# Altium schematic sheet 06_RK3588MQ.SchDoc (part 2 of 3)
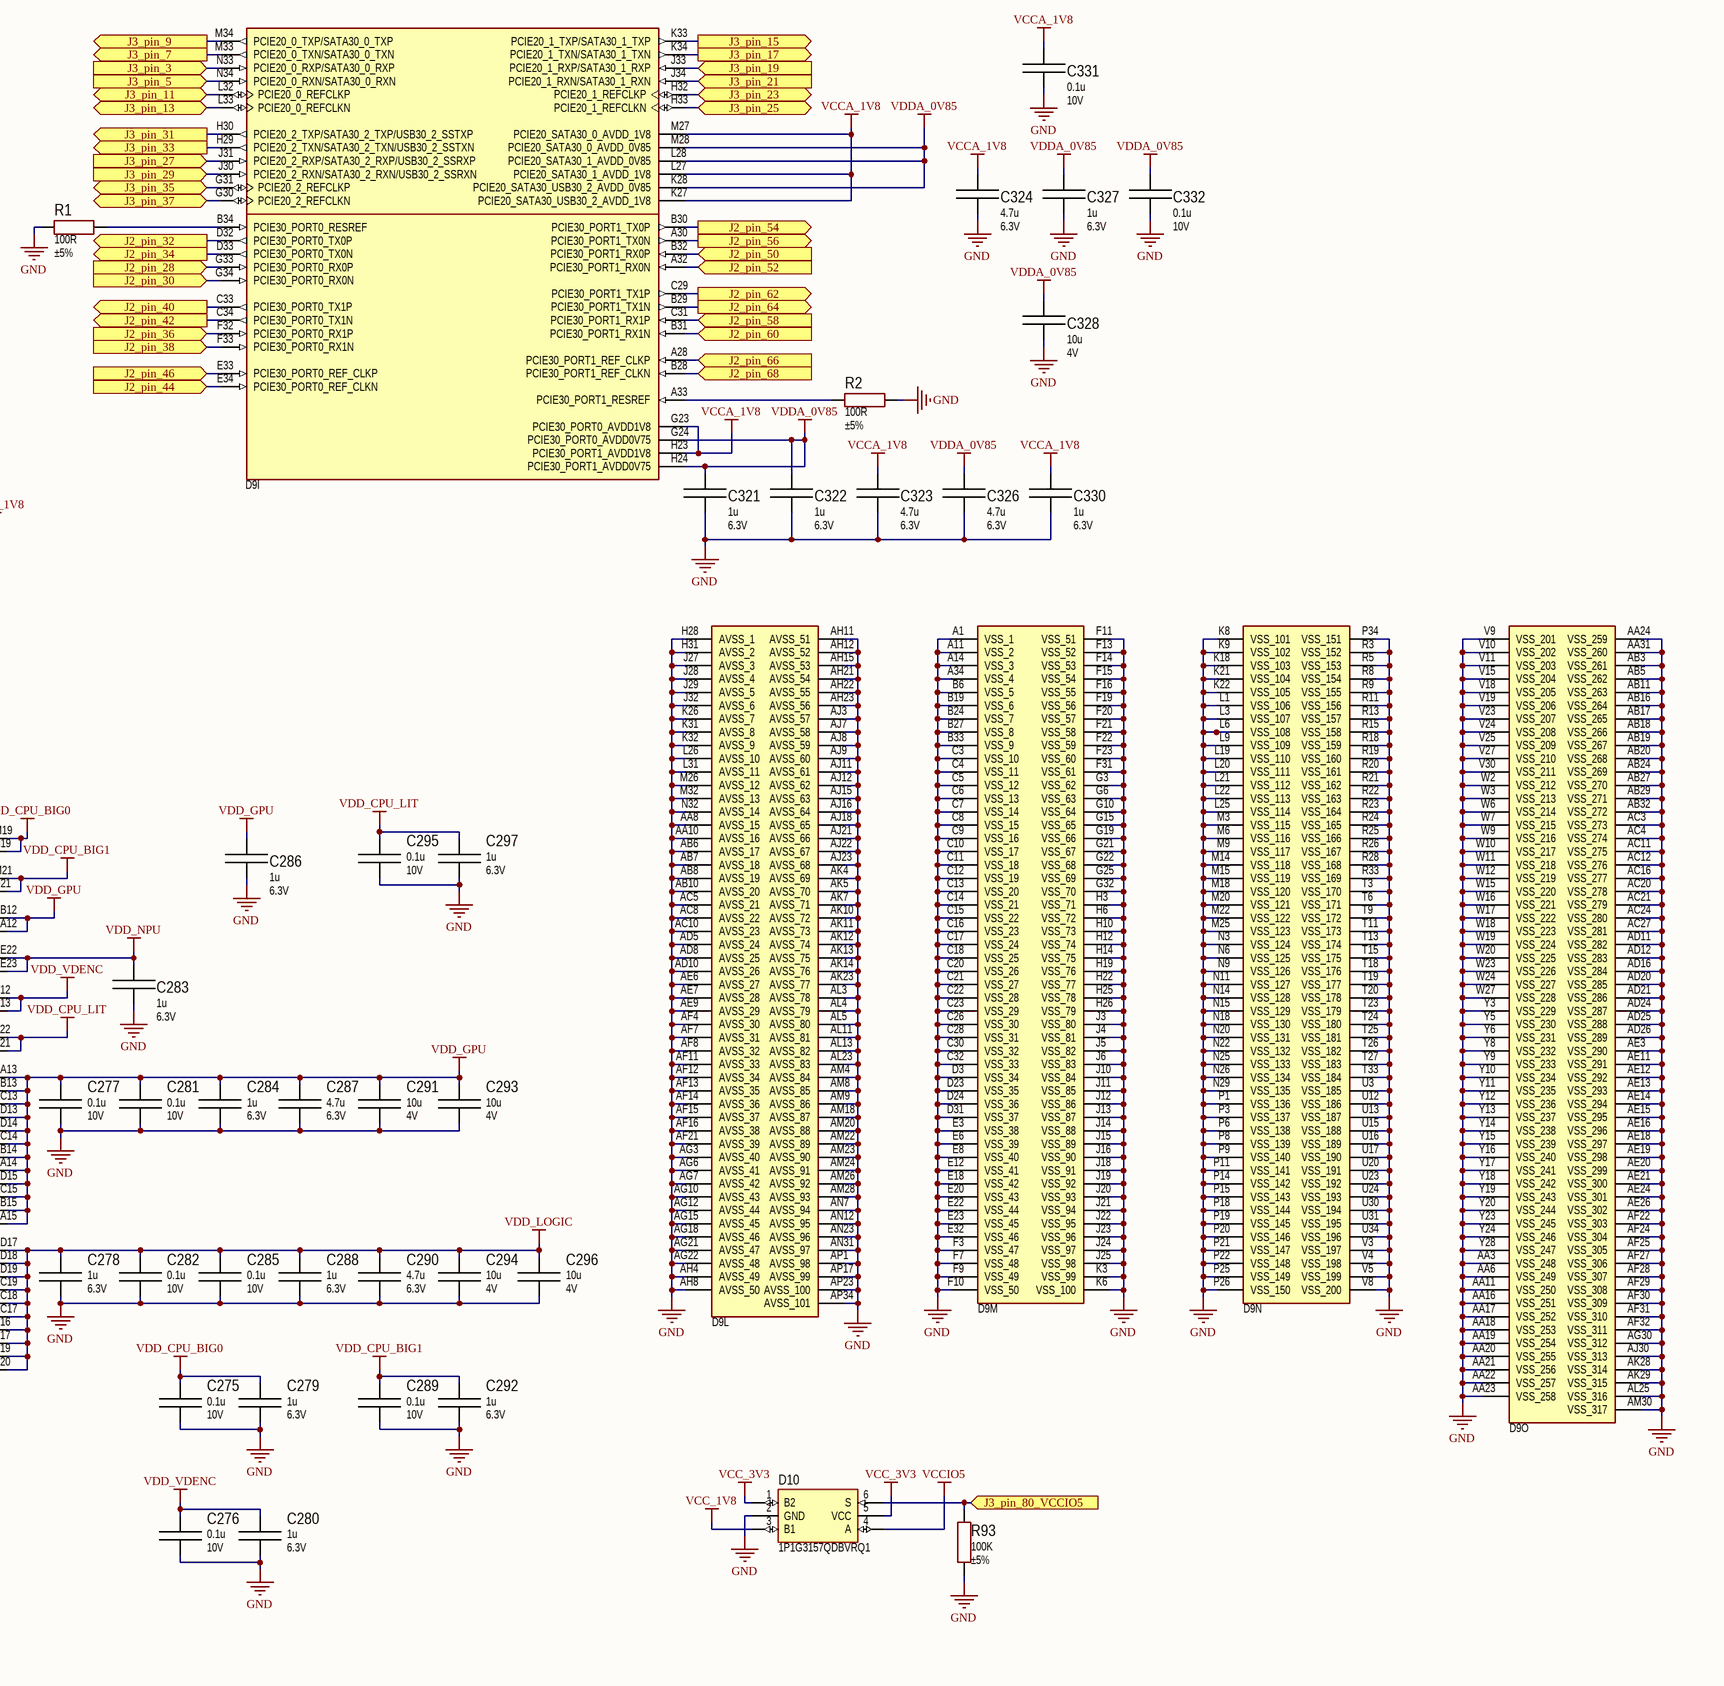
[diagram p6: 06_RK3588MQ.SchDoc, bottom right]

## Nets
GND: C193.1 C194.1 C195.1 C196.1 C197.1 C198.1 C199.1 C200.1 C201.1 C202.1 C203.1 C204.1 C205.1 C206.1 C207.1 C208.1 C209.1 C210.1 C211.1 C212.1 C214.1 C215.1 C217.1 C219.1 C220.1 C223.1 C225.1 C227.1 C228.1 C230.1 C232.1 C233.1 C234.1 C235.1 C236.1 C240.1 C241.1 C243.1 C244.1 C245.1 C246.1 C247.1 C248.1 C249.1 C250.1 C251.1 C252.1 C253.1 C254.1 C255.1 C256.1 C257.1 C258.1 C259.1 C260.1 C261.1 C262.1 C263.1 C264.1 C265.1 C266.1 C267.1 C268.1 C269.1 C270.1 C271.1 C272.1 C273.1 C274.1 C275.1 C276.1 C277.1 C278.1 C279.1 C280.1 C281.1 C282.1 C283.1 C284.1 C285.1 C286.1 C287.1 C288.1 C289.1 C290.1 C291.1 C292.1 C293.1 C294.1 C295.1 C296.1 C297.1 C303.1 C304.1 C305.1 C306.1 C307.1 C308.1 C309.1 C310.1 C311.1 C312.1 C313.1 C314.1 C316.1 C317.1 C318.1 C319.1 C320.1 C321.1 C322.1 C323.1 C324.1 C325.1 C326.1 C327.1 C328.1 C329.1 C330.1 C331.1 C332.1 C333.1 C334.1 C335.1 C336.1 C337.1 C338.1 C339.1 C340.1 C341.1 C342.1 C343.1 C344.1 C345.1 C346.1 C347.1 C348.1 C349.1 C350.1 C351.1 C352.1 D9.A1(VSS_1) D9.A11(VSS_2) D9.A14(VSS_3) D9.A34(VSS_4) D9.AA3(VSS_248) D9.AA6(VSS_249) D9.AA8(AVSS_15) D9.AA10(AVSS_16) D9.AA11(VSS_250) D9.AA16(VSS_251) D9.AA17(VSS_252) D9.AA18(VSS_253) D9.AA19(VSS_254) D9.AA20(VSS_255) D9.AA21(VSS_256) D9.AA22(VSS_257) D9.AA23(VSS_258) D9.AA24(VSS_259) D9.AA31(VSS_260) D9.AB3(VSS_261) D9.AB5(VSS_262) D9.AB6(AVSS_17) D9.AB7(AVSS_18) D9.AB8(AVSS_19) D9.AB10(AVSS_20) D9.AB11(VSS_263) D9.AB16(VSS_264) D9.AB17(VSS_265) D9.AB18(VSS_266) D9.AB19(VSS_267) D9.AB20(VSS_268) D9.AB24(VSS_269) D9.AB27(VSS_270) D9.AB29(VSS_271) D9.AB32(VSS_272) D9.AC3(VSS_273) D9.AC4(VSS_274) D9.AC5(AVSS_21) D9.AC8(AVSS_22) D9.AC10(AVSS_23) D9.AC11(VSS_275) D9.AC12(VSS_276) D9.AC16(VSS_277) D9.AC20(VSS_278) D9.AC21(VSS_279) D9.AC24(VSS_280) D9.AC27(VSS_281) D9.AD5(AVSS_24) D9.AD8(AVSS_25) D9.AD10(AVSS_26) D9.AD11(VSS_282) D9.AD12(VSS_283) D9.AD16(VSS_284) D9.AD20(VSS_285) D9.AD21(VSS_286) D9.AD24(VSS_287) D9.AD25(VSS_288) D9.AD26(VSS_289) D9.AE3(VSS_290) D9.AE6(AVSS_27) D9.AE7(AVSS_28) D9.AE9(AVSS_29) D9.AE11(VSS_291) D9.AE12(VSS_292) D9.AE13(VSS_293) D9.AE14(VSS_294) D9.AE15(VSS_295) D9.AE16(VSS_296) D9.AE18(VSS_297) D9.AE19(VSS_298) D9.AE20(VSS_299) D9.AE21(VSS_300) D9.AE24(VSS_301) D9.AE26(VSS_302) D9.AF4(AVSS_30) D9.AF7(AVSS_31) D9.AF8(AVSS_32) D9.AF11(AVSS_33) D9.AF12(AVSS_34) D9.AF13(AVSS_35) D9.AF14(AVSS_36) D9.AF15(AVSS_37) D9.AF16(AVSS_38) D9.AF21(AVSS_39) D9.AF22(VSS_303) D9.AF24(VSS_304) D9.AF25(VSS_305) D9.AF27(VSS_306) D9.AF28(VSS_307) D9.AF29(VSS_308) D9.AF30(VSS_309) D9.AF31(VSS_310) D9.AF32(VSS_311) D9.AG3(AVSS_40) D9.AG6(AVSS_41) D9.AG7(AVSS_42) D9.AG10(AVSS_43) D9.AG12(AVSS_44) D9.AG15(AVSS_45) D9.AG18(AVSS_46) D9.AG21(AVSS_47) D9.AG22(AVSS_48) D9.AG30(VSS_312) D9.AH4(AVSS_49) D9.AH8(AVSS_50) D9.AH11(AVSS_51) D9.AH12(AVSS_52) D9.AH15(AVSS_53) D9.AH21(AVSS_54) D9.AH22(AVSS_55) D9.AH23(AVSS_56) D9.AJ3(AVSS_57) D9.AJ7(AVSS_58) D9.AJ8(AVSS_59) D9.AJ9(AVSS_60) D9.AJ11(AVSS_61) D9.AJ12(AVSS_62) D9.AJ15(AVSS_63) D9.AJ16(AVSS_64) D9.AJ18(AVSS_65) D9.AJ21(AVSS_66) D9.AJ22(AVSS_67) D9.AJ23(AVSS_68) D9.AJ30(VSS_313) D9.AK4(AVSS_69) D9.AK5(AVSS_70) D9.AK7(AVSS_71) D9.AK10(AVSS_72) D9.AK11(AVSS_73) D9.AK12(AVSS_74) D9.AK13(AVSS_75) D9.AK14(AVSS_76) D9.AK23(AVSS_77) D9.AK28(VSS_314) D9.AK29(VSS_315) D9.AL3(AVSS_78) D9.AL4(AVSS_79) D9.AL5(AVSS_80) D9.AL11(AVSS_81) D9.AL13(AVSS_82) D9.AL23(AVSS_83) D9.AL25(VSS_316) D9.AM4(AVSS_84) D9.AM8(AVSS_85) D9.AM9(AVSS_86) D9.AM18(AVSS_87) D9.AM20(AVSS_88) D9.AM22(AVSS_89) D9.AM23(AVSS_90) D9.AM24(AVSS_91) D9.AM26(AVSS_92) D9.AM28(AVSS_93) D9.AM30(VSS_317) D9.AN7(AVSS_94) D9.AN12(AVSS_95) D9.AN23(AVSS_96) D9.AN31(AVSS_97) D9.AP1(AVSS_98) D9.AP17(AVSS_99) D9.AP23(AVSS_100) D9.AP34(AVSS_101) D9.B6(VSS_5) D9.B19(VSS_6) D9.B24(VSS_7) D9.B27(VSS_8) D9.B33(VSS_9) D9.C3(VSS_10) D9.C4(VSS_11) D9.C5(VSS_12) D9.C6(VSS_13) D9.C7(VSS_14) D9.C8(VSS_15) D9.C9(VSS_16) D9.C10(VSS_17) D9.C11(VSS_18) D9.C12(VSS_19) D9.C13(VSS_20) D9.C14(VSS_21) D9.C15(VSS_22) D9.C16(VSS_23) D9.C17(VSS_24) D9.C18(VSS_25) D9.C20(VSS_26) D9.C21(VSS_27) D9.C22(VSS_28) D9.C23(VSS_29) D9.C26(VSS_30) D9.C28(VSS_31) D9.C30(VSS_32) D9.C32(VSS_33) D9.D3(VSS_34) D9.D23(VSS_35) D9.D24(VSS_36) D9.D31(VSS_37) D9.E3(VSS_38) D9.E6(VSS_39) D9.E8(VSS_40) D9.E12(VSS_41) D9.E18(VSS_42) D9.E20(VSS_43) D9.E22(VSS_44) D9.E23(VSS_45) D9.E32(VSS_46) D9.F3(VSS_47) D9.F7(VSS_48) D9.F9(VSS_49) D9.F10(VSS_50) D9.F11(VSS_51) D9.F13(VSS_52) D9.F14(VSS_53) D9.F15(VSS_54) D9.F16(VSS_55) D9.F19(VSS_56) D9.F20(VSS_57) D9.F21(VSS_58) D9.F22(VSS_59) D9.F23(VSS_60) D9.F31(VSS_61) D9.G3(VSS_62) D9.G6(VSS_63) D9.G10(VSS_64) D9.G15(VSS_65) D9.G19(VSS_66) D9.G21(VSS_67) D9.G22(VSS_68) D9.G25(VSS_69) D9.G32(VSS_70) D9.H3(VSS_71) D9.H6(VSS_72) D9.H10(VSS_73) D9.H12(VSS_74) D9.H14(VSS_75) D9.H19(VSS_76) D9.H22(VSS_77) D9.H25(VSS_78) D9.H26(VSS_79) D9.H28(AVSS_1) D9.H31(AVSS_2) D9.J3(VSS_80) D9.J4(VSS_81) D9.J5(VSS_82) D9.J6(VSS_83) D9.J10(VSS_84) D9.J11(VSS_85) D9.J12(VSS_86) D9.J13(VSS_87) D9.J14(VSS_88) D9.J15(VSS_89) D9.J16(VSS_90) D9.J18(VSS_91) D9.J19(VSS_92) D9.J20(VSS_93) D9.J21(VSS_94) D9.J22(VSS_95) D9.J23(VSS_96) D9.J24(VSS_97) D9.J25(VSS_98) D9.J27(AVSS_3) D9.J28(AVSS_4) D9.J29(AVSS_5) D9.J32(AVSS_6) D9.K3(VSS_99) D9.K6(VSS_100) D9.K8(VSS_101) D9.K9(VSS_102) D9.K18(VSS_103) D9.K21(VSS_104) D9.K22(VSS_105) D9.K26(AVSS_7) D9.K31(AVSS_8) D9.K32(AVSS_9) D9.L1(VSS_106) D9.L3(VSS_107) D9.L6(VSS_108) D9.L9(VSS_109) D9.L16(DDR_CH1_PLL_AVSS) D9.L19(VSS_110) D9.L20(VSS_111) D9.L21(VSS_112) D9.L22(VSS_113) D9.L25(VSS_114) D9.L26(AVSS_10) D9.L31(AVSS_11) D9.M3(VSS_115) D9.M6(VSS_116) D9.M9(VSS_117) D9.M11(DDR_CH0_PLL_AVSS) D9.M14(VSS_118) D9.M15(VSS_119) D9.M18(VSS_120) D9.M20(VSS_121) D9.M22(VSS_122) D9.M25(VSS_123) D9.M26(AVSS_12) D9.M29(TVSS) D9.M32(AVSS_13) D9.N3(VSS_124) D9.N6(VSS_125) D9.N9(VSS_126) D9.N11(VSS_127) D9.N14(VSS_128) D9.N15(VSS_129) D9.N18(VSS_130) D9.N20(VSS_131) D9.N22(VSS_132) D9.N25(VSS_133) D9.N26(VSS_134) D9.N29(VSS_135) D9.N32(AVSS_14) D9.P1(VSS_136) D9.P3(VSS_137) D9.P6(VSS_138) D9.P8(VSS_139) D9.P9(VSS_140) D9.P11(VSS_141) D9.P14(VSS_142) D9.P15(VSS_143) D9.P18(VSS_144) D9.P19(VSS_145) D9.P20(VSS_146) D9.P21(VSS_147) D9.P22(VSS_148) D9.P25(VSS_149) D9.P26(VSS_150) D9.P34(VSS_151) D9.R3(VSS_152) D9.R5(VSS_153) D9.R8(VSS_154) D9.R9(VSS_155) D9.R11(VSS_156) D9.R13(VSS_157) D9.R15(VSS_158) D9.R18(VSS_159) D9.R19(VSS_160) D9.R20(VSS_161) D9.R21(VSS_162) D9.R22(VSS_163) D9.R23(VSS_164) D9.R24(VSS_165) D9.R25(VSS_166) D9.R26(VSS_167) D9.R28(VSS_168) D9.R33(VSS_169) D9.T3(VSS_170) D9.T6(VSS_171) D9.T9(VSS_172) D9.T11(VSS_173) D9.T13(VSS_174) D9.T15(VSS_175) D9.T18(VSS_176) D9.T19(VSS_177) D9.T20(VSS_178) D9.T23(VSS_179) D9.T24(VSS_180) D9.T25(VSS_181) D9.T26(VSS_182) D9.T27(VSS_183) D9.T33(VSS_184) D9.U3(VSS_185) D9.U12(VSS_186) D9.U13(VSS_187) D9.U15(VSS_188) D9.U16(VSS_189) D9.U17(VSS_190) D9.U19(PLL_AVSS) D9.U20(VSS_191) D9.U23(VSS_192) D9.U24(VSS_193) D9.U30(VSS_194) D9.U31(VSS_195) D9.U34(VSS_196) D9.V3(VSS_197) D9.V4(VSS_198) D9.V5(VSS_199) D9.V8(VSS_200) D9.V9(VSS_201) D9.V10(VSS_202) D9.V11(VSS_203) D9.V15(VSS_204) D9.V18(VSS_205) D9.V19(VSS_206) D9.V23(VSS_207) D9.V24(VSS_208) D9.V25(VSS_209) D9.V27(VSS_210) D9.V30(VSS_211) D9.W2(VSS_212) D9.W3(VSS_213) D9.W6(VSS_214) D9.W7(VSS_215) D9.W9(VSS_216) D9.W10(VSS_217) D9.W11(VSS_218) D9.W12(VSS_219) D9.W15(VSS_220) D9.W16(VSS_221) D9.W17(VSS_222) D9.W18(VSS_223) D9.W19(VSS_224) D9.W20(VSS_225) D9.W23(VSS_226) D9.W24(VSS_227) D9.W27(VSS_228) D9.Y3(VSS_229) D9.Y5(VSS_230) D9.Y6(VSS_231) D9.Y8(VSS_232) D9.Y9(VSS_233) D9.Y10(VSS_234) D9.Y11(VSS_235) D9.Y12(VSS_236) D9.Y13(VSS_237) D9.Y14(VSS_238) D9.Y15(VSS_239) D9.Y16(VSS_240) D9.Y17(VSS_241) D9.Y18(VSS_242) D9.Y19(VSS_243) D9.Y20(VSS_244) D9.Y23(VSS_245) D9.Y24(VSS_246) D9.Y28(VSS_247) D10.2(GND) R1.1 R2.2 R80.1 R86.1 R93.1 R94.1 R95.1 R96.2 R97.2 ZQ1.2 ZQ1.4
VCC_1V8: C199.2 C202.2 C203.2 C304.2 C305.2 C307.2 C308.2 C325.2 C333.2 C334.2 C335.2 C348.2 C352.2 D9.AA7(VCCIO2_1V8) D9.AC25(VCCIO6_1V8) D9.G20(VCCIO1_1V8) D9.H20(VCCIO4_1V8) D9.H21(VCCIO4) D9.N28(PMUIO1_1V8) D9.P28(PMUIO2) D9.R27(PMUIO2_1V8) D9.V26(EMMCIO_1V8) D9.W25(VCCIO5_1V8) D9.Y26(VCCIO3_1V8) D10.3(B1) R83.2 R84.2
VCC_3V3: C306.2 C329.2 C340.2 D9.AC26(VCCIO6) D9.AJ10(USB20_AVDD_3V3) D9.Y7(VCCIO2) D10.1(B2) D10.5(VCC)
VCCA1V8_IMAGE: C310.2 C311.2 C312.2 C313.2 C314.2 C336.2 C337.2 D9.AA26(MIPI_CSI1_AVCC1V8) D9.AB26(MIPI_CSI0_AVCC1V8) D9.AC6(HDMI/EDP_TX0_VDD_CMN_1V8) D9.AC7(HDMI/EDP_TX0_VDD_IO_1V8) D9.AD6(HDMI/EDP_TX1_VDD_CMN_1V8) D9.AD7(HDMI/EDP_TX1_VDD_IO_1V8)
VCCA_1V8: C194.2 C195.2 C209.2 C228.2 C303.2 C323.2 C324.2 C330.2 C331.2 C342.2 C343.2 C344.2 C349.2 D9.AG11(USB20_AVDD_1V8) D9.AG13(TYPEC1_DP1_VDDH_1V8) D9.AG14(TYPEC0_DP0_VDDH_1V8) D9.AH18(SARADC_AVDD_1V8) D9.G23(PCIE30_PORT0_AVDD1V8) D9.H23(PCIE30_PORT1_AVDD1V8) D9.K16(DDR_CH1_PLL_AVDD1V8) D9.K27(PCIE20_SATA30_USB30_2_AVDD_1V8) D9.L27(PCIE20_SATA30_1_AVDD_1V8) D9.M12(DDR_CH0_PLL_AVDD1V8) D9.M27(PCIE20_SATA30_0_AVDD_1V8) D9.N27(OSC_1V8) D9.U18(PLL_AVDD1V8)
VCCIO5: C309.2 D9.W26(VCCIO5) D10.4(A)
VDD2_DDR: R88.2
VDD2_DDR_CKE: C217.2 C263.2 D9.H13(DDR_CH1_VDDQ_CKE) D9.N8(DDR_CH0_VDDQ_CKE) R88.1
VDD_CPU_BIG0: C244.2 C251.2 C257.2 C265.2 C271.2 C275.2 C279.2 D9.M16(VDD_CPU_BIG0_0) D9.M17(VDD_CPU_BIG0_9) D9.M19(VDD_CPU_BIG0_MEM_0) D9.N16(VDD_CPU_BIG0_1) D9.N17(VDD_CPU_BIG0_8) D9.N19(VDD_CPU_BIG0_MEM_1) D9.P16(VDD_CPU_BIG0_2) D9.P17(VDD_CPU_BIG0_7) D9.R16(VDD_CPU_BIG0_3) D9.R17(VDD_CPU_BIG0_6) D9.T16(VDD_CPU_BIG0_4) D9.T17(VDD_CPU_BIG0_5)
VDD_CPU_BIG1: C243.2 C250.2 C258.2 C266.2 C272.2 C289.2 C292.2 D9.K23(VDD_CPU_BIG1_9) D9.K24(VDD_CPU_BIG1_0) D9.L23(VDD_CPU_BIG1_8) D9.L24(VDD_CPU_BIG1_1) D9.M21(VDD_CPU_BIG1_MEM_0) D9.M23(VDD_CPU_BIG1_7) D9.M24(VDD_CPU_BIG1_2) D9.N21(VDD_CPU_BIG1_MEM_1) D9.N23(VDD_CPU_BIG1_6) D9.N24(VDD_CPU_BIG1_3) D9.P23(VDD_CPU_BIG1_5) D9.P24(VDD_CPU_BIG1_4)
VDD_CPU_LIT: C225.2 C235.2 C249.2 C256.2 C264.2 C270.2 C295.2 C297.2 D9.T21(VDD_CPU_LIT_MEM_1) D9.T22(VDD_CPU_LIT_MEM_0) D9.U21(VDD_CPU_LIT_7) D9.U22(VDD_CPU_LIT_0) D9.V21(VDD_CPU_LIT_6) D9.V22(VDD_CPU_LIT_1) D9.W21(VDD_CPU_LIT_5) D9.W22(VDD_CPU_LIT_2) D9.Y21(VDD_CPU_LIT_4) D9.Y22(VDD_CPU_LIT_3)
VDD_DDR: C206.2 C208.2 C212.2 C215.2 C220.2 C230.2 C234.2 C241.2 C247.2 C254.2 D9.L11(DDR_CH1_VDD_0) D9.L12(DDR_CH1_VDD_1) D9.L13(DDR_CH1_VDD_2) D9.L14(DDR_CH1_VDD_3) D9.L17(DDR_CH1_VDD_MIF_0) D9.L18(DDR_CH1_VDD_MIF_1) D9.N13(DDR_CH0_VDD_MIF_0) D9.P12(DDR_CH0_VDD_3) D9.P13(DDR_CH0_VDD_MIF_1) D9.R12(DDR_CH0_VDD_2) D9.T12(DDR_CH0_VDD_1) D9.U11(DDR_CH0_VDD_0)
VDD_GPU: C277.2 C281.2 C284.2 C286.2 C287.2 C291.2 C293.2 D9.AA12(VDD_GPU_MEM_0) D9.AA13(VDD_GPU_0) D9.AA14(VDD_GPU_7) D9.AA15(VDD_GPU_11) D9.AB12(VDD_GPU_MEM_1) D9.AB13(VDD_GPU_1) D9.AB14(VDD_GPU_6) D9.AB15(VDD_GPU_10) D9.AC13(VDD_GPU_2) D9.AC14(VDD_GPU_5) D9.AC15(VDD_GPU_9) D9.AD13(VDD_GPU_3) D9.AD14(VDD_GPU_4) D9.AD15(VDD_GPU_8)
VDD_LOGIC: C278.2 C282.2 C285.2 C288.2 C290.2 C294.2 C296.2 D9.AC17(VDD_LOGIC_5) D9.AC18(VDD_LOGIC_4) D9.AC19(VDD_LOGIC_3) D9.AD17(VDD_LOGIC_0) D9.AD18(VDD_LOGIC_1) D9.AD19(VDD_LOGIC_2) D9.K19(VDD_LOGIC_8) D9.K20(VDD_LOGIC_9) D9.V16(VDD_LOGIC_6) D9.V17(VDD_LOGIC_7)
VDD_NPU: C248.2 C255.2 C261.2 C268.2 C283.2 D9.AB21(VDD_NPU_6) D9.AB22(VDD_NPU_5) D9.AB23(VDD_NPU_2) D9.AC22(VDD_NPU_4) D9.AC23(VDD_NPU_1) D9.AD22(VDD_NPU_3) D9.AD23(VDD_NPU_0) D9.AE22(VDD_NPU_MEM_0) D9.AE23(VDD_NPU_MEM_1)
VDD_VDENC: C232.2 C245.2 C252.2 C259.2 C267.2 C269.2 C276.2 C280.2 D9.R14(VDD_VDENC_0) D9.T14(VDD_VDENC_1) D9.U14(VDD_VDENC_2) D9.V12(VDD_VDENC_MEM_0) D9.V13(VDD_VDENC_MEM_1) D9.V14(VDD_VDENC_3) D9.W13(VDD_VDENC_5) D9.W14(VDD_VDENC_4)
VDDA0V75_IMAGE: C316.2 C317.2 C318.2 C319.2 C320.2 D9.AA9(HDMI/EDP_TX0_VDD_0V75) D9.AB9(HDMI/EDP_TX0_AVDD_0V75) D9.AC9(HDMI/EDP_TX1_AVDD_0V75) D9.AD9(HDMI/EDP_TX1_VDD_0V75)
VDDA_0V75: C338.2 C339.2 C341.2 C351.2 D9.AA25(MIPI_CSI1_AVCC0V75) D9.AB25(MIPI_CSI0_AVCC0V75) D9.AD3(OTP_VDDOTP_0V75) D9.AH10(USB20_DVDD_0V75) D9.V20(PLL_DVDD0V75)
VDDA_0V75_PMU: C196.2 C198.2 C200.2 C201.2 D9.P27(PMU_0V75)
VDDA_0V85: C321.2 C322.2 C326.2 C327.2 C328.2 C332.2 C345.2 C346.2 C347.2 C350.2 D9.AH13(TYPEC1_DP1_VDD_0V85) D9.AH14(TYPEC0_DP0_VDDA_0V85) D9.AJ13(TYPEC1_DP1_VDDA_0V85) D9.AJ14(TYPEC0_DP0_VDD_0V85) D9.G24(PCIE30_PORT0_AVDD0V75) D9.H24(PCIE30_PORT1_AVDD0V75) D9.K28(PCIE20_SATA30_USB30_2_AVDD_0V85) D9.L28(PCIE20_SATA30_1_AVDD_0V85) D9.M28(PCIE20_SATA30_0_AVDD_0V85)
VDDA_DDR_PLL: C211.2 C236.2 D9.L15(DDR_CH1_PLL_DVDD) D9.N12(DDR_CH0_PLL_DVDD)
VDDQ_DDR: C205.2 C207.2 C210.2 C214.2 C219.2 C223.2 C227.2 C233.2 C240.2 C246.2 C253.2 C260.2 D9.K11(DDR_CH1_VDDQ_0) D9.K12(DDR_CH1_VDDQ_1) D9.K13(DDR_CH1_VDDQ_2) D9.K14(DDR_CH1_VDDQ_3) D9.K15(DDR_CH1_VDDQ_4) D9.M10(DDR_CH0_VDDQ_0) D9.N10(DDR_CH0_VDDQ_1) D9.P10(DDR_CH0_VDDQ_2) D9.R10(DDR_CH0_VDDQ_3) D9.T10(DDR_CH0_VDDQ_4) R73.1 R76.2 R81.1 R82.2 R89.2
VDDQ_DDR_CK: C204.2 C262.2 C273.2 D9.L10(DDR_CH0_VDDQ_CK) D9.M13(DDR_CH1_VDDQ_CK) R89.1
DDR_CH0_A0_A: D9.T7(DDR_CH0_A0_A) ; port DDR_CH0_A0_A
DDR_CH0_A0_B: D9.M8(DDR_CH0_A0_B) ; port DDR_CH0_A0_B
DDR_CH0_A1_A: D9.T8(DDR_CH0_A1_A) ; port DDR_CH0_A1_A
DDR_CH0_A1_B: D9.M5(DDR_CH0_A1_B) ; port DDR_CH0_A1_B
DDR_CH0_A2_A: D9.P4(DDR_CH0_A2_A) ; port DDR_CH0_A2_A
DDR_CH0_A2_B: D9.N5(DDR_CH0_A2_B) ; port DDR_CH0_A2_B
DDR_CH0_A3_A: D9.P5(DDR_CH0_A3_A) ; port DDR_CH0_A3_A
DDR_CH0_A3_B: D9.N4(DDR_CH0_A3_B) ; port DDR_CH0_A3_B
DDR_CH0_A4_A: D9.R1(DDR_CH0_A4_A) ; port DDR_CH0_A4_A
DDR_CH0_A4_B: D9.K1(DDR_CH0_A4_B) ; port DDR_CH0_A4_B
DDR_CH0_A5_A: D9.P2(DDR_CH0_A5_A) ; port DDR_CH0_A5_A
DDR_CH0_A5_B: D9.L2(DDR_CH0_A5_B) ; port DDR_CH0_A5_B
DDR_CH0_CLKN_A: D9.N1(DDR_CH0_CKB_A) ; port DDR_CH0_CLKN_A
DDR_CH0_CLKN_B: D9.M1(DDR_CH0_CKB_B) ; port DDR_CH0_CLKN_B
DDR_CH0_CLKP_A: D9.N2(DDR_CH0_CK_A) ; port DDR_CH0_CLKP_A
DDR_CH0_CLKP_B: D9.M2(DDR_CH0_CK_B) ; port DDR_CH0_CLKP_B
DDR_CH0_DM0_A: D9.Y4(DDR_CH0_DM0_A) ; port DDR_CH0_DM0_A
DDR_CH0_DM0_B: D9.G4(DDR_CH0_DM0_B) ; port DDR_CH0_DM0_B
DDR_CH0_DM1_A: D9.AB4(DDR_CH0_DM1_A) ; port DDR_CH0_DM1_A
DDR_CH0_DM1_B: D9.E4(DDR_CH0_DM1_B) ; port DDR_CH0_DM1_B
DDR_CH0_DQ0_A: D9.U1(DDR_CH0_DQ0_A) ; port DDR_CH0_DQ0_A
DDR_CH0_DQ0_B: D9.H1(DDR_CH0_DQ0_B) ; port DDR_CH0_DQ0_B
DDR_CH0_DQ1_A: D9.T2(DDR_CH0_DQ1_A) ; port DDR_CH0_DQ1_A
DDR_CH0_DQ1_B: D9.J2(DDR_CH0_DQ1_B) ; port DDR_CH0_DQ1_B
DDR_CH0_DQ2_A: D9.T1(DDR_CH0_DQ2_A) ; port DDR_CH0_DQ2_A
DDR_CH0_DQ2_B: D9.J1(DDR_CH0_DQ2_B) ; port DDR_CH0_DQ2_B
DDR_CH0_DQ3_A: D9.R2(DDR_CH0_DQ3_A) ; port DDR_CH0_DQ3_A
DDR_CH0_DQ3_B: D9.K2(DDR_CH0_DQ3_B) ; port DDR_CH0_DQ3_B
DDR_CH0_DQ4_A: D9.W1(DDR_CH0_DQ4_A) ; port DDR_CH0_DQ4_A
DDR_CH0_DQ4_B: D9.F1(DDR_CH0_DQ4_B) ; port DDR_CH0_DQ4_B
DDR_CH0_DQ5_A: D9.V2(DDR_CH0_DQ5_A) ; port DDR_CH0_DQ5_A
DDR_CH0_DQ5_B: D9.G2(DDR_CH0_DQ5_B) ; port DDR_CH0_DQ5_B
DDR_CH0_DQ6_A: D9.V1(DDR_CH0_DQ6_A) ; port DDR_CH0_DQ6_A
DDR_CH0_DQ6_B: D9.G1(DDR_CH0_DQ6_B) ; port DDR_CH0_DQ6_B
DDR_CH0_DQ7_A: D9.U2(DDR_CH0_DQ7_A) ; port DDR_CH0_DQ7_A
DDR_CH0_DQ7_B: D9.H2(DDR_CH0_DQ7_B) ; port DDR_CH0_DQ7_B
DDR_CH0_DQ8_A: D9.AB2(DDR_CH0_DQ8_A) ; port DDR_CH0_DQ8_A
DDR_CH0_DQ8_B: D9.D2(DDR_CH0_DQ8_B) ; port DDR_CH0_DQ8_B
DDR_CH0_DQ9_A: D9.AB1(DDR_CH0_DQ9_A) ; port DDR_CH0_DQ9_A
DDR_CH0_DQ9_B: D9.C1(DDR_CH0_DQ9_B) ; port DDR_CH0_DQ9_B
DDR_CH0_DQ10_A: D9.AC1(DDR_CH0_DQ10_A) ; port DDR_CH0_DQ10_A
DDR_CH0_DQ10_B: D9.C2(DDR_CH0_DQ10_B) ; port DDR_CH0_DQ10_B
DDR_CH0_DQ11_A: D9.AC2(DDR_CH0_DQ11_A) ; port DDR_CH0_DQ11_A
DDR_CH0_DQ11_B: D9.B1(DDR_CH0_DQ11_B) ; port DDR_CH0_DQ11_B
DDR_CH0_DQ12_A: D9.Y1(DDR_CH0_DQ12_A) ; port DDR_CH0_DQ12_A
DDR_CH0_DQ12_B: D9.F2(DDR_CH0_DQ12_B) ; port DDR_CH0_DQ12_B
DDR_CH0_DQ13_A: D9.Y2(DDR_CH0_DQ13_A) ; port DDR_CH0_DQ13_A
DDR_CH0_DQ13_B: D9.E1(DDR_CH0_DQ13_B) ; port DDR_CH0_DQ13_B
DDR_CH0_DQ14_A: D9.AA1(DDR_CH0_DQ14_A) ; port DDR_CH0_DQ14_A
DDR_CH0_DQ14_B: D9.E2(DDR_CH0_DQ14_B) ; port DDR_CH0_DQ14_B
DDR_CH0_DQ15_A: D9.AA2(DDR_CH0_DQ15_A) ; port DDR_CH0_DQ15_A
DDR_CH0_DQ15_B: D9.D1(DDR_CH0_DQ15_B) ; port DDR_CH0_DQ15_B
DDR_CH0_DQS0N_A: D9.U4(DDR_CH0_DQS0N_A) ; port DDR_CH0_DQS0N_A
DDR_CH0_DQS0N_B: D9.J7(DDR_CH0_DQS0N_B) ; port DDR_CH0_DQS0N_B
DDR_CH0_DQS0P_A: D9.U5(DDR_CH0_DQS0P_A) ; port DDR_CH0_DQS0P_A
DDR_CH0_DQS0P_B: D9.J8(DDR_CH0_DQS0P_B) ; port DDR_CH0_DQS0P_B
DDR_CH0_DQS1N_A: D9.AA4(DDR_CH0_DQS1N_A) ; port DDR_CH0_DQS1N_A
DDR_CH0_DQS1N_B: D9.F4(DDR_CH0_DQS1N_B) ; port DDR_CH0_DQS1N_B
DDR_CH0_DQS1P_A: D9.AA5(DDR_CH0_DQS1P_A) ; port DDR_CH0_DQS1P_A
DDR_CH0_DQS1P_B: D9.F5(DDR_CH0_DQS1P_B) ; port DDR_CH0_DQS1P_B
DDR_CH0_LP4/4X_CKE0/LP5_CS0_A: D9.P7(DDR_CH0_LP4/4X_CKE0/LP5_CS0_A) ; port DDR_CH0_LP4/4X_CKE0/LP5_CS0_A
DDR_CH0_LP4/4X_CKE0/LP5_CS0_B: D9.L5(DDR_CH0_LP4/4X_CKE0/LP5_CS0_B) ; port DDR_CH0_LP4/4X_CKE0/LP5_CS0_B
DDR_CH0_LP4/4X_CKE1/LP5_CS1_A: D9.N7(DDR_CH0_LP4/4X_CKE1/LP5_CS1_A) ; port DDR_CH0_LP4/4X_CKE1/LP5_CS1_A
DDR_CH0_LP4/4X_CKE1/LP5_CS1_B: D9.L4(DDR_CH0_LP4/4X_CKE1/LP5_CS1_B) ; port DDR_CH0_LP4/4X_CKE1/LP5_CS1_B
DDR_CH0_LP4/4X_CS0_A: D9.R6(DDR_CH0_LP4/4X_CS0_A) ; port DDR_CH0_LP4/4X_CS0_A
DDR_CH0_LP4/4X_CS0_B: D9.L7(DDR_CH0_LP4/4X_CS0_B) ; port DDR_CH0_LP4/4X_CS0_B
DDR_CH0_LP4/4X_CS1_A: D9.R7(DDR_CH0_LP4/4X_CS1_A) ; port DDR_CH0_LP4/4X_CS1_A
DDR_CH0_LP4/4X_CS1_B: D9.L8(DDR_CH0_LP4/4X_CS1_B) ; port DDR_CH0_LP4/4X_CS1_B
DDR_CH1_A0_C: D9.G12(DDR_CH1_A0_C) ; port DDR_CH1_A0_C
DDR_CH1_A0_D: D9.H15(DDR_CH1_A0_D) ; port DDR_CH1_A0_D
DDR_CH1_A1_C: D9.F12(DDR_CH1_A1_C) ; port DDR_CH1_A1_C
DDR_CH1_A1_D: D9.G14(DDR_CH1_A1_D) ; port DDR_CH1_A1_D
DDR_CH1_A2_C: D9.E13(DDR_CH1_A2_C) ; port DDR_CH1_A2_C
DDR_CH1_A2_D: D9.G13(DDR_CH1_A2_D) ; port DDR_CH1_A2_D
DDR_CH1_A3_C: D9.D13(DDR_CH1_A3_C) ; port DDR_CH1_A3_C
DDR_CH1_A3_D: D9.E14(DDR_CH1_A3_D) ; port DDR_CH1_A3_D
DDR_CH1_A4_C: D9.A10(DDR_CH1_A4_C) ; port DDR_CH1_A4_C
DDR_CH1_A4_D: D9.A15(DDR_CH1_A4_D) ; port DDR_CH1_A4_D
DDR_CH1_A5_C: D9.B11(DDR_CH1_A5_C) ; port DDR_CH1_A5_C
DDR_CH1_A5_D: D9.B14(DDR_CH1_A5_D) ; port DDR_CH1_A5_D
DDR_CH1_CLKN_C: D9.A12(DDR_CH1_CKB_C) ; port DDR_CH1_CLKN_C
DDR_CH1_CLKN_D: D9.A13(DDR_CH1_CKB_D) ; port DDR_CH1_CLKN_D
DDR_CH1_CLKP_C: D9.B12(DDR_CH1_CK_C) ; port DDR_CH1_CLKP_C
DDR_CH1_CLKP_D: D9.B13(DDR_CH1_CK_D) ; port DDR_CH1_CLKP_D
DDR_CH1_DM0_C: D9.F8(DDR_CH1_DM0_C) ; port DDR_CH1_DM0_C
DDR_CH1_DM0_D: D9.D20(DDR_CH1_DM0_D) ; port DDR_CH1_DM0_D
DDR_CH1_DM1_C: D9.D4(DDR_CH1_DM1_C) ; port DDR_CH1_DM1_C
DDR_CH1_DM1_D: D9.D22(DDR_CH1_DM1_D) ; port DDR_CH1_DM1_D
DDR_CH1_DQ0_C: D9.A8(DDR_CH1_DQ0_C) ; port DDR_CH1_DQ0_C
DDR_CH1_DQ0_D: D9.A17(DDR_CH1_DQ0_D) ; port DDR_CH1_DQ0_D
DDR_CH1_DQ1_C: D9.B9(DDR_CH1_DQ1_C) ; port DDR_CH1_DQ1_C
DDR_CH1_DQ1_D: D9.B16(DDR_CH1_DQ1_D) ; port DDR_CH1_DQ1_D
DDR_CH1_DQ2_C: D9.A9(DDR_CH1_DQ2_C) ; port DDR_CH1_DQ2_C
DDR_CH1_DQ2_D: D9.A16(DDR_CH1_DQ2_D) ; port DDR_CH1_DQ2_D
DDR_CH1_DQ3_C: D9.B10(DDR_CH1_DQ3_C) ; port DDR_CH1_DQ3_C
DDR_CH1_DQ3_D: D9.B15(DDR_CH1_DQ3_D) ; port DDR_CH1_DQ3_D
DDR_CH1_DQ4_C: D9.A6(DDR_CH1_DQ4_C) ; port DDR_CH1_DQ4_C
DDR_CH1_DQ4_D: D9.A19(DDR_CH1_DQ4_D) ; port DDR_CH1_DQ4_D
DDR_CH1_DQ5_C: D9.B7(DDR_CH1_DQ5_C) ; port DDR_CH1_DQ5_C
DDR_CH1_DQ5_D: D9.B18(DDR_CH1_DQ5_D) ; port DDR_CH1_DQ5_D
DDR_CH1_DQ6_C: D9.A7(DDR_CH1_DQ6_C) ; port DDR_CH1_DQ6_C
DDR_CH1_DQ6_D: D9.A18(DDR_CH1_DQ6_D) ; port DDR_CH1_DQ6_D
DDR_CH1_DQ7_C: D9.B8(DDR_CH1_DQ7_C) ; port DDR_CH1_DQ7_C
DDR_CH1_DQ7_D: D9.B17(DDR_CH1_DQ7_D) ; port DDR_CH1_DQ7_D
DDR_CH1_DQ8_C: D9.A3(DDR_CH1_DQ8_C) ; port DDR_CH1_DQ8_C
DDR_CH1_DQ8_D: D9.A22(DDR_CH1_DQ8_D) ; port DDR_CH1_DQ8_D
DDR_CH1_DQ9_C: D9.B3(DDR_CH1_DQ9_C) ; port DDR_CH1_DQ9_C
DDR_CH1_DQ9_D: D9.B22(DDR_CH1_DQ9_D) ; port DDR_CH1_DQ9_D
DDR_CH1_DQ10_C: D9.A2(DDR_CH1_DQ10_C) ; port DDR_CH1_DQ10_C
DDR_CH1_DQ10_D: D9.A23(DDR_CH1_DQ10_D) ; port DDR_CH1_DQ10_D
DDR_CH1_DQ11_C: D9.B2(DDR_CH1_DQ11_C) ; port DDR_CH1_DQ11_C
DDR_CH1_DQ11_D: D9.B23(DDR_CH1_DQ11_D) ; port DDR_CH1_DQ11_D
DDR_CH1_DQ12_C: D9.A5(DDR_CH1_DQ12_C) ; port DDR_CH1_DQ12_C
DDR_CH1_DQ12_D: D9.A20(DDR_CH1_DQ12_D) ; port DDR_CH1_DQ12_D
DDR_CH1_DQ13_C: D9.B5(DDR_CH1_DQ13_C) ; port DDR_CH1_DQ13_C
DDR_CH1_DQ13_D: D9.B20(DDR_CH1_DQ13_D) ; port DDR_CH1_DQ13_D
DDR_CH1_DQ14_C: D9.A4(DDR_CH1_DQ14_C) ; port DDR_CH1_DQ14_C
DDR_CH1_DQ14_D: D9.A21(DDR_CH1_DQ14_D) ; port DDR_CH1_DQ14_D
DDR_CH1_DQ15_C: D9.B4(DDR_CH1_DQ15_C) ; port DDR_CH1_DQ15_C
DDR_CH1_DQ15_D: D9.B21(DDR_CH1_DQ15_D) ; port DDR_CH1_DQ15_D
DDR_CH1_DQS0N_C: D9.D9(DDR_CH1_DQS0N_C) ; port DDR_CH1_DQS0N_C
DDR_CH1_DQS0N_D: D9.G16(DDR_CH1_DQS0N_D) ; port DDR_CH1_DQS0N_D
DDR_CH1_DQS0P_C: D9.E9(DDR_CH1_DQS0P_C) ; port DDR_CH1_DQS0P_C
DDR_CH1_DQS0P_D: D9.H16(DDR_CH1_DQS0P_D) ; port DDR_CH1_DQS0P_D
DDR_CH1_DQS1N_C: D9.D5(DDR_CH1_DQS1N_C) ; port DDR_CH1_DQS1N_C
DDR_CH1_DQS1N_D: D9.E21(DDR_CH1_DQS1N_D) ; port DDR_CH1_DQS1N_D
DDR_CH1_DQS1P_C: D9.E5(DDR_CH1_DQS1P_C) ; port DDR_CH1_DQS1P_C
DDR_CH1_DQS1P_D: D9.D21(DDR_CH1_DQS1P_D) ; port DDR_CH1_DQS1P_D
DDR_CH1_LP4/4X_CKE0/LP5_CS0_C: D9.D11(DDR_CH1_LP4/4X_CKE0/LP5_CS0_C) ; port DDR_CH1_LP4/4X_CKE0/LP5_CS0_C
DDR_CH1_LP4/4X_CKE0/LP5_CS0_D: D9.D16(DDR_CH1_LP4/4X_CKE0/LP5_CS0_D) ; port DDR_CH1_LP4/4X_CKE0/LP5_CS0_D
DDR_CH1_LP4/4X_CKE1/LP5_CS1_C: D9.E11(DDR_CH1_LP4/4X_CKE1/LP5_CS1_C) ; port DDR_CH1_LP4/4X_CKE1/LP5_CS1_C
DDR_CH1_LP4/4X_CKE1/LP5_CS1_D: D9.E16(DDR_CH1_LP4/4X_CKE1/LP5_CS1_D) ; port DDR_CH1_LP4/4X_CKE1/LP5_CS1_D
DDR_CH1_LP4/4X_CS0_C: D9.G11(DDR_CH1_LP4/4X_CS0_C) ; port DDR_CH1_LP4/4X_CS0_C
DDR_CH1_LP4/4X_CS0_D: D9.E19(DDR_CH1_LP4/4X_CS0_D) ; port DDR_CH1_LP4/4X_CS0_D
DDR_CH1_LP4/4X_CS1_C: D9.H11(DDR_CH1_LP4/4X_CS1_C) ; port DDR_CH1_LP4/4X_CS1_C
DDR_CH1_LP4/4X_CS1_D: D9.D19(DDR_CH1_LP4/4X_CS1_D) ; port DDR_CH1_LP4/4X_CS1_D
DDR_RESET: D9.T4(DDR_CH0_RESET_A) ; port DDR_RESET
eMMC_CLKOUT: D9.V34(EMMC_CLKOUT/GPIO2_A1_D) ; port eMMC_CLKOUT
eMMC_CMD: D9.W34(EMMC_CMD/FSPI_CLK_M0/GPIO2_A0_U) ; port eMMC_CMD
eMMC_D0: D9.Y33(EMMC_D0/FSPI_D0_M0/GPIO2_D0_U) ; port eMMC_D0
eMMC_D1: D9.W33(EMMC_D1/FSPI_D1_M0/GPIO2_D1_U) ; port eMMC_D1
eMMC_D2: D9.V32(EMMC_D2/FSPI_D2_M0/GPIO2_D2_U) ; port eMMC_D2
eMMC_D3: D9.AA33(EMMC_D3/FSPI_D3_M0/GPIO2_D3_U) ; port eMMC_D3
eMMC_D4: D9.Y32(EMMC_D4/I2C1_SCL_M3/UART5_RX_M2/GPIO2_D4_U) ; port eMMC_D4
eMMC_D5: D9.AA32(EMMC_D5/I2C1_SDA_M3/UART5_TX_M2/GPIO2_D5_U) ; port eMMC_D5
eMMC_D6: D9.W32(EMMC_D6/FSPI_CS0N_M0/GPIO2_D6_U) ; port eMMC_D6
eMMC_D7: D9.V33(EMMC_D7/FSPI_CS1N_M0/GPIO2_D7_U) ; port eMMC_D7
eMMC_DATA_STROBE: D9.Y34(EMMC_DATA_STROBE/I2C2_SDA_M2/UART5_CTSN_M1/GPIO2_A2_D) ; port eMMC_DATA_STROBE
eMMC_RSTn: D9.AA34(EMMC_RSTN/I2C2_SCL_M2/UART5_RTSN_M1/GPIO2_A3_D) ; port eMMC_RSTn
I2C0_SCL_M2: D9.W30(I2S1_SDO0_M1/CPU_BIG0_AVS/I2C0_SCL_M2/UART0_CTSN/UART1_TX_M2/HDMI_RX_SDA_M0/SPI0_CS0_M0/PCIE30X2_CLKREQN_M0/HDMI_TX0_CEC_M1/GPIO0_D1_U) R83.1 ; port I2C0_SCL_M2
I2C0_SDA_M2: D9.W29(I2S1_SDO1_M1/I2C0_SDA_M2/UART1_RX_M2/HDMI_RX_SCL_M0/SPI3_MOSI_M2/PCIE30X2_WAKEN_M0/HDMI_TX1_CEC_M1/GPIO0_D2_U) R84.1 ; port I2C0_SDA_M2
J1_pin_22_3V3: D9.AK25(CIF_HREF/BT1120_D8/I2S1_SDO1_M0/PCIE30X1_1_BUTTON_RSTN/I2C7_SCL_M3/UART8_RTSN_M0/PWM14_M1/SPI0_CS0_M1/CAN1_RX_M1/GPIO4_B2_U) ; port J1_pin_22_3V3
J1_pin_23_3V3: D9.AL24(MIPI_CAMERA0_CLK_M0/SPDIF1_TX_M1/I2S1_SDO0_M0/PCIE30X1_0_BUTTON_RSTN/SATA2_ACT_LED_M0/I2C6_SCL_M3/UART8_RX_M0/SPI0_CS1_M1/GPIO4_B1_U) ; port J1_pin_23_3V3
J1_pin_24_VCCIO5: D9.AH25(CIF_D9/FSPI_CS1N_M2/PCIE30X4_WAKEN_M2/HDMI_TX1_SDA_M1/CAN2_TX_M0/UART5_RX_M1/SPI3_CS1_M3/GPIO3_C5_U_VCCIO_5) ; port J1_pin_24_VCCIO5
J1_pin_25_3V3: D9.AK24(BT1120_D15/SPDIF1_TX_M2/PCIE20X1_2_PERSTN_M1/HDMI_TX0_CEC_M0/I2C8_SDA_M3/PWM6_M1/SPI3_CS1_M1/GPIO4_C1_D) ; port J1_pin_25_3V3
J1_pin_26_VCCIO5: D9.AG26(CIF_D10/PCIE30X4_PERSTN_M2/HDMI_TX1_SCL_M1/SPI3_MISO_M3/GPIO3_C6_U_VCCIO_5) ; port J1_pin_26_VCCIO5
J1_pin_27_3V3: D9.AJ25(BT1120_D14/PCIE20X1_2_WAKEN_M1/HDMI_TX0_SDA_M0/I2C8_SCL_M3/SPI3_CS0_M1/GPIO4_C0_U) ; port J1_pin_27_3V3
J1_pin_28_VCCIO5: D9.AH26(CIF_D8/FSPI_CS0N_M2/PCIE30X4_CLKREQN_M2/HDMI_TX1_CEC_M2/CAN2_RX_M0/UART5_TX_M1/SPI3_CS0_M3/GPIO3_C4_U_VCCIO_5) ; port J1_pin_28_VCCIO5
J1_pin_29_3V3: D9.AJ28(BT1120_D13/PCIE20X1_2_CLKREQN_M1/HDMI_TX0_SCL_M0/I2C5_SDA_M1/SPI3_CLK_M1/GPIO4_B7_U) ; port J1_pin_29_3V3
J1_pin_30_3V3: D9.AL26(CIF_CLKOUT/BT1120_D10/I2S1_SDO3_M0/PCIE30X4_CLKREQN_M1/DP0_HPDIN_M0/SPDIF0_TX_M1/UART9_TX_M1/PWM11_IR_M1/GPIO4_B4_U) ; port J1_pin_30_3V3
J1_pin_31_3V3: D9.AK8(TYPEC1_USB20_OTG_ID) ; port J1_pin_31_3V3
J1_pin_32_3V3: D9.AK30(CIF_D0/BT1120_D0/I2S1_MCLK_M0/PCIE30X1_1_CLKREQN_M1/UART9_RTSN_M1/SPI0_MISO_M1/GPIO4_A0_D) ; port J1_pin_32_3V3
J1_pin_33_3V3: D9.AL8(TYPEC1_USB20_VBUSDET) ; port J1_pin_33_3V3
J1_pin_34_3V3: D9.AL30(CIF_D1/BT1120_D1/I2S1_SCLK_M0/PCIE30X1_1_WAKEN_M1/UART9_CTSN_M1/SPI0_MOSI_M1/GPIO4_A1_D) ; port J1_pin_34_3V3
J1_pin_35_1V8: D9.AL14(TYPEC0_USB20_OTG_ID) ; port J1_pin_35_1V8
J1_pin_36_3V3: D9.AJ27(BT1120_D12/PCIE30X4_PERSTN_M1/HDMI_RX_HPDOUT_M0/SATA0_ACT_LED_M0/I2C5_SCL_M1/PWM13_M1/SPI3_MOSI_M1/GPIO4_B6_D) ; port J1_pin_36_3V3
J1_pin_37_3V3: D9.AM14(TYPEC0_USB20_VBUSDET) ; port J1_pin_37_3V3
J1_pin_38_3V3: D9.AJ26(BT1120_D11/PCIE30X4_WAKEN_M1/HDMI_RX_CEC_M0/SATA1_ACT_LED_M0/UART9_RX_M1/PWM12_M1/SPI3_MISO_M1/GPIO4_B5_D) ; port J1_pin_38_3V3
J1_pin_39_VCCIO5: D9.AG25(CIF_D14/PCIE30X2_CLKREQN_M2/HDMI_RX_SCL_M1/I2C7_SCL_M2/UART9_RTSN_M2/SPI0_MOSI_M3/GPIO3_D2_D_VCCIO_5) ; port J1_pin_39_VCCIO5
J1_pin_40_3V3: D9.AM29(CIF_D2/BT1120_D2/I2S1_LRCK_M0/PCIE30X1_1_PERSTN_M1/SPI0_CLK_M1/GPIO4_A2_D) ; port J1_pin_40_3V3
J1_pin_41_VCCIO5: D9.AG24(CIF_D15/PCIE30X2_WAKEN_M2/HDMI_RX_SDA_M1/I2C7_SDA_M2/UART9_CTSN_M2/PWM10_M2/SPI0_CLK_M3/GPIO3_D3_D_VCCIO_5) ; port J1_pin_41_VCCIO5
J1_pin_42_3V3: D9.AK26(CIF_CLKIN/BT1120_CLKOUT/I2S1_SDI3_M0/PCIE30X2_PERSTN_M1/I2C6_SDA_M3/UART8_TX_M0/SPI2_CS1_M1/GPIO4_B0_D) ; port J1_pin_42_3V3
J1_pin_43_VCCIO5: D9.AG23(CIF_D13/PCIE20X1_2_PERSTN_M0/HDMI_RX_CEC_M1/UART4_TX_M1/PWM9_M2/SPI0_MISO_M3/GPIO3_D1_D_VCCIO_5) ; port J1_pin_43_VCCIO5
J1_pin_46_1V8: D9.P31(SDMMC_DET/GPIO0_A4_U) ; port J1_pin_46_1V8
J1_pin_48_VCCIO_SD_S0: D9.AD1(SDMMC_D1/PDM1_SDI2_M0/JTAG_TMS_M1/I2C3_SDA_M4/UART2_RX_M1/PWM9_M1/GPIO4_D1_U) ; port J1_pin_48_VCCIO_SD_S0
J1_pin_50_VCCIO_SD_S0: D9.AD2(SDMMC_D0/PDM1_SDI3_M0/JTAG_TCK_M1/I2C3_SCL_M4/UART2_TX_M1/PWM8_M1/GPIO4_D0_U) ; port J1_pin_50_VCCIO_SD_S0
J1_pin_52_VCCIO_SD_S0: D9.AE1(SDMMC_CLK/PDM1_CLK0_M0/TEST_CLKOUT_M0/MCU_JTAG_TMS_M0/CAN0_RX_M1/UART5_TX_M0/GPIO4_D5_D) ; port J1_pin_52_VCCIO_SD_S0
J1_pin_54_VCCIO_SD_S0: D9.AE2(SDMMC_CMD/PDM1_CLK1_M0/MCU_JTAG_TCK_M0/CAN0_TX_M1/UART5_RX_M0/PWM7_IR_M1/GPIO4_D4_U) ; port J1_pin_54_VCCIO_SD_S0
J1_pin_56_VCCIO_SD_S0: D9.AF1(SDMMC_D3/PDM1_SDI0_M0/JTAG_TMS_M0/I2C8_SDA_M0/UART5_RTSN_M0/PWM10_M1/GPIO4_D3_U) ; port J1_pin_56_VCCIO_SD_S0
J1_pin_58_VCCIO_SD_S0: D9.AF2(SDMMC_D2/PDM1_SDI1_M0/JTAG_TCK_M0/I2C8_SCL_M0/UART5_CTSN_M0/GPIO4_D2_U) ; port J1_pin_58_VCCIO_SD_S0
J1_pin_62_3V3: D9.AM27(CIF_D7/BT1120_D7/I2S1_SDI2_M0/PCIE30X2_WAKEN_M1/I2C5_SDA_M2/SPI2_CS0_M1/GPIO4_A7_D) ; port J1_pin_62_3V3
J1_pin_64_3V3: D9.AL27(CIF_D6/BT1120_D6/I2S1_SDI1_M0/PCIE30X2_CLKREQN_M1/I2C5_SCL_M2/UART3_RX_M2/SPI2_CLK_M1/GPIO4_A6_D) ; port J1_pin_64_3V3
J1_pin_65: D9.AK6(USB20_HOST0_DP) ; port J1_pin_65
J1_pin_66: D9.AN8(TYPEC1_SSRX1P/DP1_TX0P) ; port J1_pin_66
J1_pin_67: D9.AL6(USB20_HOST0_DM) ; port J1_pin_67
J1_pin_68: D9.AP8(TYPEC1_SSRX1N/DP1_TX0N) ; port J1_pin_68
J1_pin_69: D9.AL7(USB20_HOST1_DP) ; port J1_pin_69
J1_pin_70: D9.AN9(TYPEC1_SSTX1N/DP1_TX1N) ; port J1_pin_70
J1_pin_71: D9.AM7(USB20_HOST1_DM) ; port J1_pin_71
J1_pin_72: D9.AP9(TYPEC1_SSTX1P/DP1_TX1P) ; port J1_pin_72
J1_pin_73: D9.AK9(TYPEC1_USB20_OTG_DP) ; port J1_pin_73
J1_pin_74: D9.AN10(TYPEC1_SSRX2P/DP1_TX2P) ; port J1_pin_74
J1_pin_75: D9.AL9(TYPEC1_USB20_OTG_DM) ; port J1_pin_75
J1_pin_76: D9.AP10(TYPEC1_SSRX2N/DP1_TX2N) ; port J1_pin_76
J1_pin_77: D9.AL10(TYPEC1_SBU1/DP1_AUXP) ; port J1_pin_77
J1_pin_78: D9.AN11(TYPEC1_SSTX2N/DP1_TX3N) ; port J1_pin_78
J1_pin_79: D9.AM10(TYPEC1_SBU2/DP1_AUXN) ; port J1_pin_79
J1_pin_80: D9.AP11(TYPEC1_SSTX2P/DP1_TX3P) ; port J1_pin_80
J2_pin_28: D9.G33(PCIE30_PORT0_RX0P) ; port J2_pin_28
J2_pin_30: D9.G34(PCIE30_PORT0_RX0N) ; port J2_pin_30
J2_pin_32: D9.D32(PCIE30_PORT0_TX0P) ; port J2_pin_32
J2_pin_34: D9.D33(PCIE30_PORT0_TX0N) ; port J2_pin_34
J2_pin_36: D9.F32(PCIE30_PORT0_RX1P) ; port J2_pin_36
J2_pin_38: D9.F33(PCIE30_PORT0_RX1N) ; port J2_pin_38
J2_pin_40: D9.C33(PCIE30_PORT0_TX1P) ; port J2_pin_40
J2_pin_41: D9.AP16(TYPEC0_SSTX2P/DP0_TX3P) ; port J2_pin_41
J2_pin_42: D9.C34(PCIE30_PORT0_TX1N) ; port J2_pin_42
J2_pin_43: D9.AN16(TYPEC0_SSTX2N/DP0_TX3N) ; port J2_pin_43
J2_pin_44: D9.E34(PCIE30_PORT0_REF_CLKN) ; port J2_pin_44
J2_pin_45: D9.AP15(TYPEC0_SSRX2N/DP0_TX2N) ; port J2_pin_45
J2_pin_46: D9.E33(PCIE30_PORT0_REF_CLKP) ; port J2_pin_46
J2_pin_47: D9.AN15(TYPEC0_SSRX2P/DP0_TX2P) ; port J2_pin_47
J2_pin_49: D9.AP14(TYPEC0_SSTX1P/DP0_TX1P) ; port J2_pin_49
J2_pin_50: D9.B32(PCIE30_PORT1_RX0P) ; port J2_pin_50
J2_pin_51: D9.AN14(TYPEC0_SSTX1N/DP0_TX1N) ; port J2_pin_51
J2_pin_52: D9.A32(PCIE30_PORT1_RX0N) ; port J2_pin_52
J2_pin_53: D9.AP13(TYPEC0_SSRX1N/DP0_TX0N) ; port J2_pin_53
J2_pin_54: D9.B30(PCIE30_PORT1_TX0P) ; port J2_pin_54
J2_pin_55: D9.AN13(TYPEC0_SSRX1P/DP0_TX0P) ; port J2_pin_55
J2_pin_56: D9.A30(PCIE30_PORT1_TX0N) ; port J2_pin_56
J2_pin_58: D9.C31(PCIE30_PORT1_RX1P) ; port J2_pin_58
J2_pin_60: D9.B31(PCIE30_PORT1_RX1N) ; port J2_pin_60
J2_pin_62: D9.C29(PCIE30_PORT1_TX1P) ; port J2_pin_62
J2_pin_64: D9.B29(PCIE30_PORT1_TX1N) ; port J2_pin_64
J2_pin_66: D9.A28(PCIE30_PORT1_REF_CLKP) ; port J2_pin_66
J2_pin_68: D9.B28(PCIE30_PORT1_REF_CLKN) ; port J2_pin_68
J2_pin_94_1V8: D9.AM15(TYPEC0_SBU2/DP0_AUXN) ; port J2_pin_94_1V8
J2_pin_96_1V8: D9.AL15(TYPEC0_SBU1/DP0_AUXP) ; port J2_pin_96_1V8
J2_pin_98: D9.AM12(TYPEC0_USB20_OTG_DM) ; port J2_pin_98
J2_pin_100: D9.AL12(TYPEC0_USB20_OTG_DP) ; port J2_pin_100
J3_pin_2_3V3: D9.AL28(CIF_D4/BT1120_D4/PCIE30X1_0_WAKEN_M1/I2C3_SCL_M2/UART0_RX_M2/SPI2_MISO_M1/GPIO4_A4_D) ; port J3_pin_2_3V3
J3_pin_3: D9.N33(PCIE20_0_RXP/SATA30_0_RXP) ; port J3_pin_3
J3_pin_4_3V3: D9.AL29(CIF_D3/BT1120_D3/PCIE30X1_0_CLKREQN_M1/UART0_TX_M2/GPIO4_A3_D) ; port J3_pin_4_3V3
J3_pin_5: D9.N34(PCIE20_0_RXN/SATA30_0_RXN) ; port J3_pin_5
J3_pin_6_1V8: D9.V31(I2S1_SDI2_M1/PDM0_SDI0_M1/I2C6_SDA_M0/UART1_RTSN_M2/PWM6_M0/SPI0_MISO_M0/PCIE30X4_WAKEN_M0/GPIO0_C7_D) ; port J3_pin_6_1V8
J3_pin_7: D9.M33(PCIE20_0_TXN/SATA30_0_TXN) ; port J3_pin_7
J3_pin_8_1V8: D9.W31(I2S1_SDI3_M1/PDM0_SDI1_M1/I2C6_SCL_M0/UART1_CTSN_M2/PWM7_IR_M0/SPI3_MISO_M2/PCIE30X4_PERSTN_M0/GPIO0_D0_D) ; port J3_pin_8_1V8
J3_pin_9: D9.M34(PCIE20_0_TXP/SATA30_0_TXP) ; port J3_pin_9
J3_pin_10_1V8: D9.T31(PDM0_CLK0_M1/PWM1_M0/I2C2_SDA_M0/CAN0_RX_M0/SPI0_MOSI_M0/PCIE30X1_0_CLKREQN_M0/GPIO0_C0_D) ; port J3_pin_10_1V8
J3_pin_11: D9.L32(PCIE20_0_REFCLKP) ; port J3_pin_11
J3_pin_12_1V8: D9.T28(I2S1_LRCK_M1/PWM0_M0/I2C2_SCL_M0/CAN0_TX_M0/SPI0_CS1_M0/PCIE30X1_1_PERSTN_M0/GPIO0_B7_D) ; port J3_pin_12_1V8
J3_pin_13: D9.L33(PCIE20_0_REFCLKN) ; port J3_pin_13
J3_pin_14_1V8: D9.V28(I2S1_SDO3_M1/CPU_BIG1_AVS/I2C1_SDA_M2/CAN2_TX_M1/HDMI_TX0_SCL_M1/SPI3_CS1_M2/SATA_MP_SWITCH/GPIO0_D5_U) ; port J3_pin_14_1V8
J3_pin_15: D9.K33(PCIE20_1_TXP/SATA30_1_TXP) ; port J3_pin_15
J3_pin_16_1V8: D9.V29(I2S1_SDO2_M1/PDM0_SDI2_M1/PWM3_IR_M0/I2C1_SCL_M2/CAN2_RX_M1/HDMI_TX0_SDA_M1/SPI3_CS0_M2/PCIE30X2_PERSTN_M0/SATA_CPDET/GPIO0_D4_U) ; port J3_pin_16_1V8
J3_pin_17: D9.K34(PCIE20_1_TXN/SATA30_1_TXN) ; port J3_pin_17
J3_pin_18_1V8: D9.T29(I2S1_SDI1_M1/NPU_AVS/UART0_RTSN/PWM5_M1/SPI0_CLK_M0/PCIE30X4_CLKREQN_M0/SATA_CP_POD/GPIO0_C6_U) ; port J3_pin_18_1V8
J3_pin_19: D9.J33(PCIE20_1_RXP/SATA30_1_RXP) ; port J3_pin_19
J3_pin_20_VCCIO5: D9.Y29(GMAC1_PPSTRIG/I2C3_SDA_M1/UART7_TX_M1/SPI1_MISO_M1/GPIO3_C0_D) ; port J3_pin_20_VCCIO5
J3_pin_21: D9.J34(PCIE20_1_RXN/SATA30_1_RXN) ; port J3_pin_21
J3_pin_22_VCCIO5: D9.AA27(HDMI_TX0_HPD_M1/PCIE30X2_PERSTN_M2/HDMI_RX_HPDOUT_M1/MCU_JTAG_TCK_M1/UART9_RX_M2/SPI0_CS0_M3/GPIO3_D4_D) ; port J3_pin_22_VCCIO5
J3_pin_23: D9.H32(PCIE20_1_REFCLKP) ; port J3_pin_23
J3_pin_24_1V8: D9.G29(I2C3_SDA_M0/UART3_RX_M0/SPI4_MISO_M0/GPIO1_C0_Z) ; port J3_pin_24_1V8
J3_pin_25: D9.H33(PCIE20_1_REFCLKN) ; port J3_pin_25
J3_pin_26_1V8: D9.G27(I2C3_SCL_M0/UART3_TX_M0/SPI4_MOSI_M0/GPIO1_C1_Z) ; port J3_pin_26_1V8
J3_pin_27: D9.J31(PCIE20_2_RXP/SATA30_2_RXP/USB30_2_SSRXP) ; port J3_pin_27
J3_pin_28_UART2_RX_M0_DEBUG: D9.R29(I2S1_SCLK_M1/JTAG_TMS_M2/I2C1_SDA_M0/UART2_RX_M0/PCIE30X1_1_WAKEN_M0/GPIO0_B6_D) ; port J3_pin_28_UART2_RX_M0_DEBUG
J3_pin_29: D9.J30(PCIE20_2_RXN/SATA30_2_RXN/USB30_2_SSRXN) ; port J3_pin_29
J3_pin_30_UART2_TX_M0_DEBUG: D9.P29(I2S1_MCLK_M1/JTAG_TCK_M2/I2C1_SCL_M0/UART2_TX_M0/PCIE30X1_1_CLKREQN_M0/GPIO0_B5_D) ; port J3_pin_30_UART2_TX_M0_DEBUG
J3_pin_31: D9.H30(PCIE20_2_TXP/SATA30_2_TXP/USB30_2_SSTXP) ; port J3_pin_31
J3_pin_32_VCCIO5: D9.Y27(GMAC1_PPSCLK/PCIE30X2_BUTTON_RSTN/UART7_RX_M1/SPI1_CLK_M1/GPIO3_C1_D) ; port J3_pin_32_VCCIO5
J3_pin_33: D9.H29(PCIE20_2_TXN/SATA30_2_TXN/USB30_2_SSTXN) ; port J3_pin_33
J3_pin_34_1V8: D9.R30(PDM0_CLK1_M1/PWM2_M0/UART0_RX_M0/I2C4_SDA_M2/DP0_HPDIN_M1/PCIE30X1_0_WAKEN_M0/GPIO0_C4_D) ; port J3_pin_34_1V8
J3_pin_35: D9.G31(PCIE20_2_REFCLKP) ; port J3_pin_35
J3_pin_36_1V8: D9.P30(I2S1_SDI0_M1/GPU_AVS/UART0_TX_M0/I2C4_SCL_M2/DP1_HPDIN_M1/PWM4_M0/PCIE30X1_0_PERSTN_M0/GPIO0_C5_U) ; port J3_pin_36_1V8
J3_pin_37: D9.G30(PCIE20_2_REFCLKN) ; port J3_pin_37
J3_pin_38_1V8: D9.K29(CLK32K_IN/CLK32K_OUT0/GPIO0_B2__U) ; port J3_pin_38_1V8
J3_pin_40_1V8: D9.L30(SPI2_CS1_M2/I2C1_SCL_M1/UART0_RX_M1/GPIO0_B0_Z) ; port J3_pin_40_1V8
J3_pin_41_1V8: D9.AB31(GMAC0_PTP_REFCLK/FSPI_CS0N_M1/HDMI_TX1_SDA_M0/I2C4_SDA_M1/UART7_RX_M0/GPIO2_B4_U) ; port J3_pin_41_1V8
J3_pin_42_1V8: D9.P33(REFCLK_OUT/GPIO0_A0_D) ; port J3_pin_42_1V8
J3_pin_43_1V8: D9.F30(I2S0_MCLK/I2C6_SDA_M1/UART3_RTSN/PWM3_IR_M2/SPI4_CLK_M0/GPIO1_C2_D) ; port J3_pin_43_1V8
J3_pin_44_1V8: D9.A27(HDMI_TX1_SDA_M2/I2C4_SCL_M3/UART6_CTSN_M1/PWM1_M2/SPI4_CS0_M2/GPIO1_A3_D) ; port J3_pin_44_1V8
J3_pin_45_1V8: D9.E29(I2S0_SDO0/I2C4_SCL_M4/UART4_CTSN/GPIO1_C7_D) ; port J3_pin_45_1V8
J3_pin_46_1V8: D9.B26(HDMI_TX0_HPD_M0/SPI2_MOSI_M0/GPIO1_A5_D) ; port J3_pin_46_1V8
J3_pin_47_1V8: D9.E31(I2S0_SCLK/I2C6_SCL_M1/UART3_CTSN/PWM7_IR_M2/SPI4_CS0_M0/GPIO1_C3_D) ; port J3_pin_47_1V8
J3_pin_48_1V8: D9.A26(VOP_POST_EMPTY/I2C4_SDA_M3/UART6_RTSN_M1/PWM0_M2/SPI4_CLK_M2/GPIO1_A2_D) ; port J3_pin_48_1V8
J3_pin_49_1V8: D9.D30(I2S0_LRCK/I2C2_SCL_M3/UART4_RTSN/GPIO1_C5_D) ; port J3_pin_49_1V8
J3_pin_50_1V8: D9.B25(HDMI_TX1_SCL_M2/SPI2_MISO_M0/GPIO1_A4_D) ; port J3_pin_50_1V8
J3_pin_51_1V8: D9.D28(I2S0_SDI0/GPIO1_D4_D) ; port J3_pin_51_1V8
J3_pin_52_1V8: D9.A25(PCIE30X1_1_WAKEN_M2/DP1_HPDIN_M2/SATA1_ACT_LED_M1/I2C2_SCL_M4/UART6_TX_M1/SPI4_MOSI_M2/GPIO1_A1_D) ; port J3_pin_52_1V8
J3_pin_53_1V8: D9.D29(PDM0_CLK0_M0/I2C4_SDA_M4/PWM15_IR_M2/GPIO1_C6_D) ; port J3_pin_53_1V8
J3_pin_54_1V8: D9.A24(PCIE30X1_1_CLKREQN_M2/DP0_HPDIN_M2/I2C2_SDA_M4/UART6_RX_M1/SPI4_MISO_M2/GPIO1_A0_D) ; port J3_pin_54_1V8
J3_pin_55_1V8: D9.E30(PDM0_CLK1_M0/I2C2_SDA_M3/PWM11_IR_M2/SPI4_CS1_M0/GPIO1_C4_D) ; port J3_pin_55_1V8
J3_pin_56_1V8: D9.F28(I2S0_SDO3/I2S0_SDI2/PDM0_SDI2_M0/I2C1_SCL_M4/UART4_TX_M0/PWM0_M1/SPI1_CLK_M2/GPIO1_D2_D) ; port J3_pin_56_1V8
J3_pin_57_1V8: D9.E27(MIPI_CAMERA2_CLK_M0/SPDIF1_TX_M0/PCIE30X2_PERSTN_M3/HDMI_RX_CEC_M2/SATA2_ACT_LED_M1/I2C5_SDA_M3/UART1_RX_M1/PWM13_M2/GPIO1_B7_U) ; port J3_pin_57_1V8
J3_pin_58_1V8: D9.G26(PDM0_SDI0_M0/SPI1_CS1_M2/GPIO1_D5_D) ; port J3_pin_58_1V8
J3_pin_59_1V8: D9.E26(MIPI_CAMERA1_CLK_M0/SPDIF0_TX_M0/PCIE30X2_WAKEN_M3/HDMI_RX_HPDOUT_M2/I2C5_SCL_M3/UART1_TX_M1/GPIO1_B6_U) ; port J3_pin_59_1V8
J3_pin_60_1V8: D9.E28(I2S0_SDI1/PDM0_SDI3_M0/I2C1_SDA_M4/UART4_RX_M0/PWM1_M1/SPI1_CS0_M2/GPIO1_D3_D) ; port J3_pin_60_1V8
J3_pin_61_1V8: D9.F25(MIPI_CAMERA4_CLK_M0/PCIE30X2_CLKREQN_M3/HDMI_RX_SDA_M2/I2C8_SDA_M2/UART1_CTSN_M1/PWM15_IR_M3/GPIO1_D7_U) ; port J3_pin_61_1V8
J3_pin_62_1V8: D9.F27(I2S0_SDO2/I2S0_SDI3/PDM0_SDI1_M0/I2C7_SDA_M0/UART6_RX_M2/SPI1_MOSI_M2/GPIO1_D1_D) ; port J3_pin_62_1V8
J3_pin_63_1V8: D9.F24(MIPI_CAMERA3_CLK_M0/HDMI_RX_SCL_M2/I2C8_SCL_M2/UART1_RTSN_M1/PWM14_M2/GPIO1_D6_U) ; port J3_pin_63_1V8
J3_pin_64_1V8: D9.F26(I2S0_SDO1/I2C7_SCL_M0/UART6_TX_M2/SPI1_MISO_M2/GPIO1_D0_D) ; port J3_pin_64_1V8
J3_pin_66_1V8: D9.C27(PDM1_SDI1_M1/PCIE30X4_CLKREQN_M3/SPI2_CS1_M0/GPIO1_B0_U) ; port J3_pin_66_1V8
J3_pin_67_VCCIO5: D9.AB28(PCIE30X4_BUTTON_RSTN/DP1_HPDIN_M0/MCU_JTAG_TMS_M1/UART9_TX_M2/PWM11_IR_M3/SPI0_CS1_M3/GPIO3_D5_D) ; port J3_pin_67_VCCIO5
J3_pin_68_1V8: D9.D27(PDM1_CLK1_M1/PCIE30X1_0_WAKEN_M2/SATA0_ACT_LED_M1/UART4_TX_M2/SPI0_CLK_M2/GPIO1_B3_D) ; port J3_pin_68_1V8
J3_pin_69_1V8: D9.AB30(GMAC0_PPSTRIG/FSPI_CS1N_M1/HDMI_TX1_SCL_M0/I2C4_SCL_M1/UART7_TX_M0/GPIO2_B5_U) ; port J3_pin_69_1V8
J3_pin_70_1V8: D9.D26(PDM1_SDI3_M1/PCIE30X4_PERSTN_M3/UART4_RX_M2/SPI0_MOSI_M2/GPIO1_B2_D) ; port J3_pin_70_1V8
J3_pin_71_1V8: D9.AC30(GMAC0_PPSCLK/TEST_CLKOUT_M1/HDMI_TX1_CEC_M0/UART9_RX_M0/SPI1_CS1_M0/GPIO2_C4_D) ; port J3_pin_71_1V8
J3_pin_72_1V8: D9.E25(PCIE30X1_0_CLKREQN_M2/UART7_TX_M2/SPI0_CS1_M2/GPIO1_B5_U) ; port J3_pin_72_1V8
J3_pin_73_1V8: D9.D25(PDM1_SDI2_M1/PCIE30X4_WAKEN_M3/SPI0_MISO_M2/GPIO1_B1_D) ; port J3_pin_73_1V8
J3_pin_74_VCCIO5: D9.AE28(GMAC1_TXER/I2S2_SDI_M1/UART2_RX_M2/PWM3_IR_M1/GPIO3_B2_D) ; port J3_pin_74_VCCIO5
J3_pin_75_1V8: D9.C25(PDM1_SDI0_M1/PCIE30X1_1_PERSTN_M2/PWM3_IR_M3/SPI2_CS0_M0/GPIO1_A7_U) ; port J3_pin_75_1V8
J3_pin_76_VCCIO5: D9.AJ24(CIF_D11/PCIE20X1_2_CLKREQN_M0/HDMI_TX0_SCL_M2/I2C5_SCL_M0/SPI3_MOSI_M3/GPIO3_C7_U_VCCIO_5) ; port J3_pin_76_VCCIO5
J3_pin_77_1V8: D9.C24(HDMI_TX1_HPD_M0/SPI2_CLK_M0/GPIO1_A6_D) ; port J3_pin_77_1V8
J3_pin_78_VCCIO5: D9.AH24(CIF_D12/PCIE20X1_2_WAKEN_M0/HDMI_TX0_SDA_M2/I2C5_SDA_M0/UART4_RX_M1/PWM8_M2/SPI3_CLK_M3/GPIO3_D0_U_VCCIO_5) ; port J3_pin_78_VCCIO5
J3_pin_79_1V8: D9.E24(PDM1_CLK0_M1/PCIE30X1_0_PERSTN_M2/UART7_RX_M2/SPI0_CS0_M2/GPIO1_B4_U) ; port J3_pin_79_1V8
J3_pin_80_VCCIO5: D10.6(S) R93.2 ; port J3_pin_80_VCCIO5
J4_pin_35_1V8: D9.AN17(SARADC_IN3) ; port J4_pin_35_1V8
J4_pin_37_1V8: D9.AM16(SARADC_IN0_BOOT) ; port J4_pin_37_1V8
J4_pin_38_1V8: D9.U33(LITCPU_AVS/SPI3_CLK_M2/GPIO0_D3_U) ; port J4_pin_38_1V8
J4_pin_39_1V8: D9.AL16(SARADC_IN1) ; port J4_pin_39_1V8
J4_pin_40_1V8: D9.AF33(GMAC0_TXER/I2C0_SDA_M1/UART7_CTSN_M0/PWM7_IR_M3/SPI3_CLK_M0/GPIO4_C6_D) ; port J4_pin_40_1V8
J4_pin_41_1V8: D9.AK17(SARADC_IN7) ; port J4_pin_41_1V8
J4_pin_42_1V8: C274.2 D9.M31(NPOR) R90.1 R92.1 ; port J4_pin_42_1V8
J4_pin_43_3V3: D9.AK27(CIF_D5/BT1120_D5/I2S1_SDI0_M0/PCIE30X1_0_PERSTN_M1/I2C3_SDA_M2/UART3_TX_M2/SPI2_MOSI_M1/GPIO4_A5_D) ; port J4_pin_43_3V3
J4_pin_46_3V3: D9.AM25(CIF_VSYNC/BT1120_D9/I2S1_SDO2_M0/PCIE20X1_2_BUTTON_RSTN/I2C7_SDA_M3/UART8_CTSN_M0/PWM15_IR_M1/CAN1_TX_M1/GPIO4_B3_U) ; port J4_pin_46_3V3
J4_pin_47_1V8: D9.AE33(GMAC0_TXCLK/SDIO_CLK_M0/FSPI_CLK_M1/I2C3_SDA_M3/GPIO2_B3_D) ; port J4_pin_47_1V8
J4_pin_49_1V8: D9.AE34(GMAC0_TXEN/I2S2_LRCK_M0/I2C2_SDA_M1/UART1_RTSN_M0/SPI1_CLK_M0/GPIO2_C0_D) ; port J4_pin_49_1V8
J4_pin_50_1V8: D9.AD30(ETH0_REFCLKO_25M/I2S2_SDI_M0/I2C6_SCL_M2/SPI1_CS0_M0/GPIO2_C3_D) ; port J4_pin_50_1V8
J4_pin_51_1V8: D9.AD33(GMAC0_TXD0/I2S2_MCLK_M0/I2C5_SCL_M4/UART1_RX_M0/GPIO2_B6_D) ; port J4_pin_51_1V8
J4_pin_52_1V8: D9.AE31(GMAC0_RXDV_CRS/UART7_RTSN_M0/PWM2_M2/SPI3_CS0_M0/GPIO4_C2_D) ; port J4_pin_52_1V8
J4_pin_53_1V8: D9.AD34(GMAC0_TXD1/I2S2_SCLK_M0/I2C5_SDA_M4/UART1_TX_M0/GPIO2_B7_D) ; port J4_pin_53_1V8
J4_pin_54_1V8: D9.AE32(GMAC0_RXCLK/SDIO_D2_M0/FSPI_D2_M1/I2C8_SCL_M1/UART6_RTSN_M0/GPIO2_B0_U) ; port J4_pin_54_1V8
J4_pin_55_1V8: D9.AC33(GMAC0_TXD2/SDIO_D3_M0/FSPI_D3_M1/I2C8_SDA_M1/UART6_CTSN_M0/GPIO2_B1_U) ; port J4_pin_55_1V8
J4_pin_56_1V8: D9.AD31(GMAC0_RXD1/I2C6_SDA_M2/UART9_TX_M0/SPI1_MOSI_M0/GPIO2_C2_D) ; port J4_pin_56_1V8
J4_pin_57_1V8: D9.AC34(GMAC0_TXD3/SDIO_CMD_M0/I2C3_SCL_M3/GPIO2_B2_U) ; port J4_pin_57_1V8
J4_pin_58_1V8: D9.AD32(GMAC0_RXD0/I2C2_SCL_M1/UART1_CTSN_M0/SPI1_MISO_M0/GPIO2_C1_D) ; port J4_pin_58_1V8
J4_pin_59_VCCIO5: D9.AH30(GMAC1_RXCLK/SDIO_CLK_M1/MIPI_CAMERA0_CLK_M1/FSPI_CLK_M2/I2C4_SDA_M0/UART8_CTSN_M1/GPIO3_A5_D) ; port J4_pin_59_VCCIO5
J4_pin_60_1V8: D9.AC31(GMAC0_RXD3/SDIO_D1_M0/FSPI_D1_M1/UART6_TX_M0/GPIO2_A7_U) ; port J4_pin_60_1V8
J4_pin_61_VCCIO5: D9.AH29(GMAC1_RXDV_CRS/MIPI_CAMERA4_CLK_M1/UART2_TX_M2/PWM2_M1/GPIO3_B1_D) ; port J4_pin_61_VCCIO5
J4_pin_62_1V8: D9.AC32(GMAC0_RXD2/SDIO_D0_M0/FSPI_D0_M1/UART6_RX_M0/GPIO2_A6_U) ; port J4_pin_62_1V8
J4_pin_63_VCCIO5: D9.AG29(GMAC1_RXD0/MIPI_CAMERA2_CLK_M1/PWM8_M0/GPIO3_A7_U) ; port J4_pin_63_VCCIO5
J4_pin_64_1V8: D9.AF34(GMAC0_MCLKINOUT/I2S2_SDO_M0/I2C7_SCL_M1/PWM4_M1/SPI3_CS1_M0/GPIO4_C3_D) ; port J4_pin_64_1V8
J4_pin_65_VCCIO5: D9.AG28(GMAC1_RXD1/MIPI_CAMERA3_CLK_M1/PWM9_M0/GPIO3_B0_U) ; port J4_pin_65_VCCIO5
J4_pin_66_VCCIO5: D9.AH27(ETH1_REFCLKO_25M/MIPI_CAMERA1_CLK_M1/I2C4_SCL_M0/GPIO3_A6_D_VCCIO_5) ; port J4_pin_66_VCCIO5
J4_pin_67_VCCIO5: D9.AE27(GMAC1_RXD3/SDIO_D3_M1/I2S3_SDO/AUDDSM_RN/FSPI_D3_M2/UART8_RX_M1/SPI4_CS0_M1/GPIO3_A3_U) ; port J4_pin_67_VCCIO5
J4_pin_68_1V8: D9.AB33(GMAC0_MDIO/I2C0_SCL_M1/UART9_CTSN_M0/PWM6_M2/SPI3_MOSI_M0/GPIO4_C5_D) ; port J4_pin_68_1V8
J4_pin_69_VCCIO5: D9.AD27(GMAC1_RXD2/SDIO_D2_M1/I2S3_LRCK/AUDDSM_LP/FSPI_D2_M2/UART8_TX_M1/SPI4_CLK_M1/GPIO3_A2_U) ; port J4_pin_69_VCCIO5
J4_pin_70_1V8: D9.AB34(GMAC0_MDC/I2C7_SDA_M1/UART9_RTSN_M0/PWM5_M2/SPI3_MISO_M0/GPIO4_C4_D) ; port J4_pin_70_1V8
J4_pin_71_VCCIO5: D9.AD28(GMAC1_TXCLK/SDIO_CMD_M1/I2S3_SDI/AUDDSM_RP/UART8_RTSN_M1/SPI4_CS1_M1/GPIO3_A4_D) ; port J4_pin_71_VCCIO5
J4_pin_72_VCCIO5: D9.AE29(GMAC1_MCLKINOUT/I2S2_LRCK_M1/CAN1_TX_M0/UART3_RX_M1/PWM13_M0/GPIO3_B6_D) ; port J4_pin_72_VCCIO5
J4_pin_73_VCCIO5: D9.AC28(GMAC1_TXD0/I2S2_SDO_M1/UART2_RTSN/GPIO3_B3_U) ; port J4_pin_73_VCCIO5
J4_pin_74_VCCIO5: D9.AD29(GMAC1_TXEN/I2S2_SCLK_M1/CAN1_RX_M0/UART3_TX_M1/PWM12_M0/GPIO3_B5_U) ; port J4_pin_74_VCCIO5
J4_pin_75_VCCIO5: D9.AC29(GMAC1_TXD1/I2S2_MCLK_M1/UART2_CTSN/GPIO3_B4_U) ; port J4_pin_75_VCCIO5
J4_pin_76_VCCIO5: D9.Y31(GMAC1_MDC/MIPI_TE0/I2C8_SCL_M4/UART7_RTSN_M1/PWM14_M0/SPI1_CS0_M1/GPIO3_C2_D) ; port J4_pin_76_VCCIO5
J4_pin_77_VCCIO5: D9.AA30(GMAC1_TXD3/SDIO_D1_M1/I2S3_SCLK/AUDDSM_LN/FSPI_D1_M2/I2C6_SCL_M4/PWM11_IR_M0/SPI4_MOSI_M1/GPIO3_A1_U) ; port J4_pin_77_VCCIO5
J4_pin_78_VCCIO5: D9.Y30(GMAC1_MDIO/MIPI_TE1/I2C8_SDA_M4/UART7_CTSN_M1/PWM15_IR_M0/SPI1_CS1_M1/GPIO3_C3_D) ; port J4_pin_78_VCCIO5
J4_pin_79_VCCIO5: D9.AA29(GMAC1_TXD2/SDIO_D0_M1/I2S3_MCLK/FSPI_D0_M2/I2C6_SDA_M4/PWM10_M0/SPI4_MISO_M1/GPIO3_A0_U) ; port J4_pin_79_VCCIO5
J4_pin_80_VCCIO5: D9.AA28(GMAC1_PTP_REF_CLK/HDMI_TX1_HPD_M1/I2C3_SCL_M1/SPI1_MOSI_M1/GPIO3_B7_D) ; port J4_pin_80_VCCIO5
MIPI_CSI0_CLK0_N: D9.AJ34(MIPI_CSI0_CLK0N) ; port J4_pin_24
MIPI_CSI0_CLK0_P: D9.AJ33(MIPI_CSI0_CLK0P) ; port J4_pin_22
MIPI_CSI0_CLK1_N: D9.AM34(MIPI_CSI0_CLK1N) ; port J4_pin_12
MIPI_CSI0_CLK1_P: D9.AM33(MIPI_CSI0_CLK1P) ; port J4_pin_10
MIPI_CSI0_D0_N: D9.AG34(MIPI_CSI0_D0N) ; port J4_pin_32
MIPI_CSI0_D0_P: D9.AG33(MIPI_CSI0_D0P) ; port J4_pin_30
MIPI_CSI0_D1_N: D9.AH34(MIPI_CSI0_D1N) ; port J4_pin_28
MIPI_CSI0_D1_P: D9.AH33(MIPI_CSI0_D1P) ; port J4_pin_26
MIPI_CSI0_D2_N: D9.AK34(MIPI_CSI0_D2N) ; port J4_pin_20
MIPI_CSI0_D2_P: D9.AK33(MIPI_CSI0_D2P) ; port J4_pin_18
MIPI_CSI0_D3_N: D9.AL34(MIPI_CSI0_D3N) ; port J4_pin_16
MIPI_CSI0_D3_P: D9.AL33(MIPI_CSI0_D3P) ; port J4_pin_14
PMIC_INT_L: D9.M30(PMIC_INT_L/GPIO0_A7_U) ; port PMIC_INT_L
PMIC_PWR_CTRL1: D9.R32(PMIC_SLEEP1/GPIO0_A2_D) ; port PMIC_PWR_CTRL1
PMIC_PWR_CTRL2: R85.2 R86.2 ; port PMIC_PWR_CTRL2
PMIC_PWR_CTRL3: R78.2 R79.2 R80.2 ; port PMIC_PWR_CTRL3
PMIC_SPI_CLK: D9.N31(SPI2_CLK_M2/SDMMC_PWREN/PMU_DEBUG/GPIO0_A5_D) ; port PMIC_SPI_CLK
PMIC_SPI_CS: R87.2 ; port PMIC_SPI_CS
PMIC_SPI_MOSI: R77.2 R91.1 ; port PMIC_SPI_MOSI
RESET_L: R92.2 ; port RESET_L
SPI2_CS0_M2: D9.K30(SPI2_CS0_M2/I2C1_SDA_M1/PWM5_M0/UART0_TX_M1/GPIO0_B1_Z) R87.1
SPI2_MISO_M2: D9.L29(SPI2_MISO_M2/I2C0_SCL_M0/GPIO0_B3_Z) R77.1 R79.1
SPI2_MOSI_M2: D9.N30(SPI2_MOSI_M2/I2C0_SDA_M0/GPIO0_A6_Z) R91.2
TSADC_SHUT_H: D9.P32(TSADC_SHUT_ORG/TSADC_SHUT/GPIO0_A1_Z) R90.2
VSEL2: D9.R31(PMIC_SLEEP2/GPIO0_A3_D) ; port VSEL2
VSEL3: D9.U32(PMIC_SLEEP3/GPIO0_C1_D) ; port VSEL3
VSEL4: D9.T32(PMIC_SLEEP4/GPIO0_C2_D) R78.1
VSEL5: D9.T30(PMIC_SLEEP5/GPIO0_C3_D) R85.1
VSEL6: D9.W28(PMIC_SLEEP6/PDM0_SDI3_M1/GPIO0_D6_D) ; port VSEL6
XIN24M: C197.2 D9.R34(XIN_24M) R75.1 ZQ1.3
XOUT24M: D9.T34(XOUT_24M) R74.2 R75.2
NetC193_2: C193.2 R74.1 ZQ1.1
NetD9_A33: D9.A33(PCIE30_PORT1_RESREF) R2.1
NetD9_AG9: D9.AG9(USB20_HOST0_REXT) R94.2
NetD9_AG16: D9.AG16(TYPEC1_DP1_REXT) R97.1
NetD9_AH9: D9.AH9(USB20_HOST1_REXT) R96.1
NetD9_AH16: D9.AH16(TYPEC0_DP0_REXT) R95.2
NetD9_B34: D9.B34(PCIE30_PORT0_RESREF) R1.2
NetD9_F18: D9.F18(DDR_CH1_ZQ_D) R82.1
NetD9_G8: D9.G8(DDR_CH1_ZQ_C) R81.2
NetD9_H7: D9.H7(DDR_CH0_ZQ_B) R76.1
NetD9_W8: D9.W8(DDR_CH0_ZQ_A) R73.2

Not connected (* = marked no-connect by the designer): D9 AD4(NC)* AE4(HDMI_RX_VPH3V3)* AE5(HDMI_RX_DVDD3V3)* AE8(HDMI_RX_AVDD0V75)* AE30(CLK32K_OUT1/GPIO2_C5_D)* AF3(HDMI_RX_REXT)* AF5(HDMI_RX_CLKN)* AF6(HDMI_RX_CLKP)* AF18(TSADC_TEST_OUT_TS)* AF19(MIPI_D/C_PHY1_VREG)* AF20(MIPI_D/C_PHY0_VREG)* AG1(HDMI_TX0_SBDN/EDP_TX0_AUXN)* AG2(HDMI_TX0_SBDP/EDP_TX0_AUXP)* AG4(HDMI_RX_D0N)* AG5(HDMI_RX_D0P)* AG19(MIPI_D/C_PHY1_VDD)* AG20(MIPI_D/C_PHY0_VDD)* AG31(MIPI_CSI1_D0P)* AG32(MIPI_CSI1_D0N)* AH2(HDMI_TX0_D3N/EDP_TX0_D3N)* AH3(HDMI_TX0_D3P/EDP_TX0_D3P)* AH5(HDMI_RX_D1N)* AH6(HDMI_RX_D1P)* AH19(MIPI_D/C_PHY1_VDD_1V2)* AH20(MIPI_D/C_PHY0_VDD_1V2)* AH31(MIPI_CSI1_D1P)* AH32(MIPI_CSI1_D1N)* AJ1(HDMI_TX0_D0N/EDP_TX0_D0N)* AJ2(HDMI_TX0_D0P/EDP_TX0_D0P)* AJ4(HDMI_RX_D2N)* AJ5(HDMI_RX_D2P)* AJ19(MIPI_D/C_PHY1_VDD_1V8)* AJ20(MIPI_D/C_PHY0_VDD_1V8)* AJ31(MIPI_CSI1_CLK0P)* AJ32(MIPI_CSI1_CLK0N)* AK2(HDMI_TX0_D1N/EDP_TX0_D1N)* AK3(HDMI_TX0_D1P/EDP_TX0_D1P)* AK15(SARADC_IN5)* AK16(SARADC_IN2)* AK18(MIPI_DPHY1_RX_D0P/MIPI_CPHY1_RX_TRIO0_B)* AK19(MIPI_DPHY1_RX_D1P/MIPI_CPHY1_RX_TRIO1_A)* AK20(MIPI_DPHY1_RX_CLKP/MIPI_CPHY1_RX_TRIO1_C)* AK21(MIPI_DPHY1_RX_D2P/MIPI_CPHY1_RX_TRIO2_B)* AK22(MIPI_DPHY1_RX_D3P/NO_USE)* AK31(MIPI_CSI1_D2P)* AK32(MIPI_CSI1_D2N)* AL1(HDMI_TX0_D2N/EDP_TX0_D2N)* AL2(HDMI_TX0_D2P/EDP_TX0_D2P)* AL17(SARADC_IN6)* AL18(MIPI_DPHY1_RX_D0N/MIPI_CPHY1_RX_TRIO0_A)* AL19(MIPI_DPHY1_RX_D1N/MIPI_CPHY1_RX_TRIO0_C)* AL20(MIPI_DPHY1_RX_CLKN/MIPI_CPHY1_RX_TRIO1_B)* AL21(MIPI_DPHY1_RX_D2N/MIPI_CPHY1_RX_TRIO2_A)* AL22(MIPI_DPHY1_RX_D3N/MIPI_CPHY1_RX_TRIO2_C)* AL31(MIPI_CSI1_D3P)* AL32(MIPI_CSI1_D3N)* AM2(HDMI/EDP_TX0_REXT)* AM3(HDMI_TX1_D3P/EDP_TX1_D3P)* AM5(HDMI_TX1_D1P/EDP_TX1_D1P)* AM17(SARADC_IN4)* AM31(MIPI_CSI1_CLK1P)* AM32(MIPI_CSI1_CLK1N)* AN1(HDMI/EDP_TX1_REXT)* AN2(HDMI_TX1_SBDP/EDP_TX1_AUXP)* AN3(HDMI_TX1_D3N/EDP_TX1_D3N)* AN4(HDMI_TX1_D0P/EDP_TX1_D0P)* AN5(HDMI_TX1_D1N/EDP_TX1_D1N)* AN6(HDMI_TX1_D2P/EDP_TX1_D2P)* AN18(MIPI_DPHY1_TX_D0P/MIPI_CPHY1_TX_TRIO0_B)* AN19(MIPI_DPHY1_TX_D1P/MIPI_CPHY1_TX_TRIO1_A)* AN20(MIPI_DPHY1_TX_CLKP/MIPI_CPHY1_TX_TRIO1_C)* AN21(MIPI_DPHY1_TX_D2P/MIPI_CPHY1_TX_TRIO2_B)* AN22(MIPI_DPHY1_TX_D3P/NO_USE)* AN24(MIPI_DPHY0_TX_D0P/MIPI_CPHY0_TX_TRIO0_B)* AN25(MIPI_DPHY0_TX_D1P/MIPI_CPHY0_TX_TRIO1_A)* AN26(MIPI_DPHY0_TX_CLKP/MIPI_CPHY0_TX_TRIO1_C)* AN27(MIPI_DPHY0_TX_D2P/MIPI_CPHY0_TX_TRIO2_B)* AN28(MIPI_DPHY0_TX_D3P/NO_USE)* AN29(MIPI_DPHY0_RX_D0P/MIPI_CPHY0_RX_TRIO0_B)* AN30(MIPI_DPHY0_RX_D1P/MIPI_CPHY0_RX_TRIO1_A)* AN32(MIPI_DPHY0_RX_CLKP/MIPI_CPHY0_RX_TRIO1_C)* AN33(MIPI_DPHY0_RX_D2P/MIPI_CPHY0_RX_TRIO2_B)* AN34(MIPI_DPHY0_RX_D3P/NO_USE)* AP2(HDMI_TX1_SBDN/EDP_TX1_AUXN)* AP4(HDMI_TX1_D0N/EDP_TX1_D0N)* AP6(HDMI_TX1_D2N/EDP_TX1_D2N)* AP7(TYPEC1_USB20_OTG1_REXT)* AP12(TYPEC0_USB20_OTG0_REXT)* AP18(MIPI_DPHY1_TX_D0N/MIPI_CPHY1_TX_TRIO0_A)* AP19(MIPI_DPHY1_TX_D1N/MIPI_CPHY1_TX_TRIO0_C)* AP20(MIPI_DPHY1_TX_CLKN/MIPI_CPHY1_TX_TRIO1_B)* AP21(MIPI_DPHY1_TX_D2N/MIPI_CPHY1_TX_TRIO2_A)* AP22(MIPI_DPHY1_TX_D3N/MIPI_CPHY1_TX_TRIO2_C)* AP24(MIPI_DPHY0_TX_D0N/MIPI_CPHY0_TX_TRIO0_A)* AP25(MIPI_DPHY0_TX_D1N/MIPI_CPHY0_TX_TRIO0_C)* AP26(MIPI_DPHY0_TX_CLKN/MIPI_CPHY0_TX_TRIO1_B)* AP27(MIPI_DPHY0_TX_D2N/MIPI_CPHY0_TX_TRIO2_A)* AP28(MIPI_DPHY0_TX_D3N/MIPI_CPHY0_TX_TRIO2_C)* AP29(MIPI_DPHY0_RX_D0N/MIPI_CPHY0_RX_TRIO0_A)* AP30(MIPI_DPHY0_RX_D1N/MIPI_CPHY0_RX_TRIO0_C)* AP31(MIPI_DPHY0_RX_CLKN/MIPI_CPHY0_RX_TRIO1_B)* AP32(MIPI_DPHY0_RX_D2N/MIPI_CPHY0_RX_TRIO2_A)* AP33(MIPI_DPHY0_RX_D3N/MIPI_CPHY0_RX_TRIO2_C)* C19(DDR_CH1_RESET_D)* D7(DDR_CH1_WCK1P_C)* D10(DDR_CH1_A6_C)* D14(DDR_CH1_A6_D)* D17(DDR_CH1_WCK0N_D)* E7(DDR_CH1_WCK1N_C)* E10(DDR_CH1_RESET_C)* E17(DDR_CH1_WCK0P_D)* G9(DDR_CH1_WCK0P_C)* G18(DDR_CH1_WCK1N_D)* H4(DDR_CH0_WCK1P_B)* H5(DDR_CH0_WCK1N_B)* H9(DDR_CH1_WCK0N_C)* H18(DDR_CH1_WCK1P_D)* K4(DDR_CH0_WCK0N_B)* K5(DDR_CH0_WCK0P_B)* K7(DDR_CH0_RESET_B)* M7(DDR_CH0_A6_B)* T5(DDR_CH0_A6_A)* V6(DDR_CH0_WCK0N_A)* V7(DDR_CH0_WCK0P_A)* W4(DDR_CH0_WCK1P_A)* W5(DDR_CH0_WCK1N_A)*

## Layout directives
net class MIPI_CSI0: MIPI_CSI0_CLK0_N, MIPI_CSI0_CLK0_P, MIPI_CSI0_CLK1_N, MIPI_CSI0_CLK1_P, MIPI_CSI0_D0_N, MIPI_CSI0_D0_P, MIPI_CSI0_D1_N, MIPI_CSI0_D1_P, MIPI_CSI0_D2_N, MIPI_CSI0_D2_P, MIPI_CSI0_D3_N, MIPI_CSI0_D3_P

## Notes on the sheet
- DWG. NO.
- REV.
- SHT.
- REVISION
- DESCRIPTION
- DATE
- APPROVED
- THIS DOCUMENT AND THE DATA DISCLOSED HEREIN OR HEREWITH IS THE PROPERTY OF ALTIUM LIMITED AND MAY BE FREELY DISTRIBUTED IN WHOLE. NO RIGHTS ARE RESERVED OR EXPRESS OR IMPLIED WARANTEE GIVEN.
- ENG:
- DSN:
- APPROVALS
- PROJECT
- DOCUMENT REVISION:
- DESIGN ITEM:
- CHK:
- BOM:
- REFERENCE DOCUMENTS
- PROJECT REVISION:
- TITLE
- FAB DWG:
- PCB DWG:
- ASSY DWG:
- SCALE:
- SIZE
- D
- CAGE CODE
- FILE NAME
- DWG NO.
- SHEET
- OF
- REV